# EAGLE schematic MeadowF7MicroDebug_REVB (EAGLE 9.2.2)
REV: A
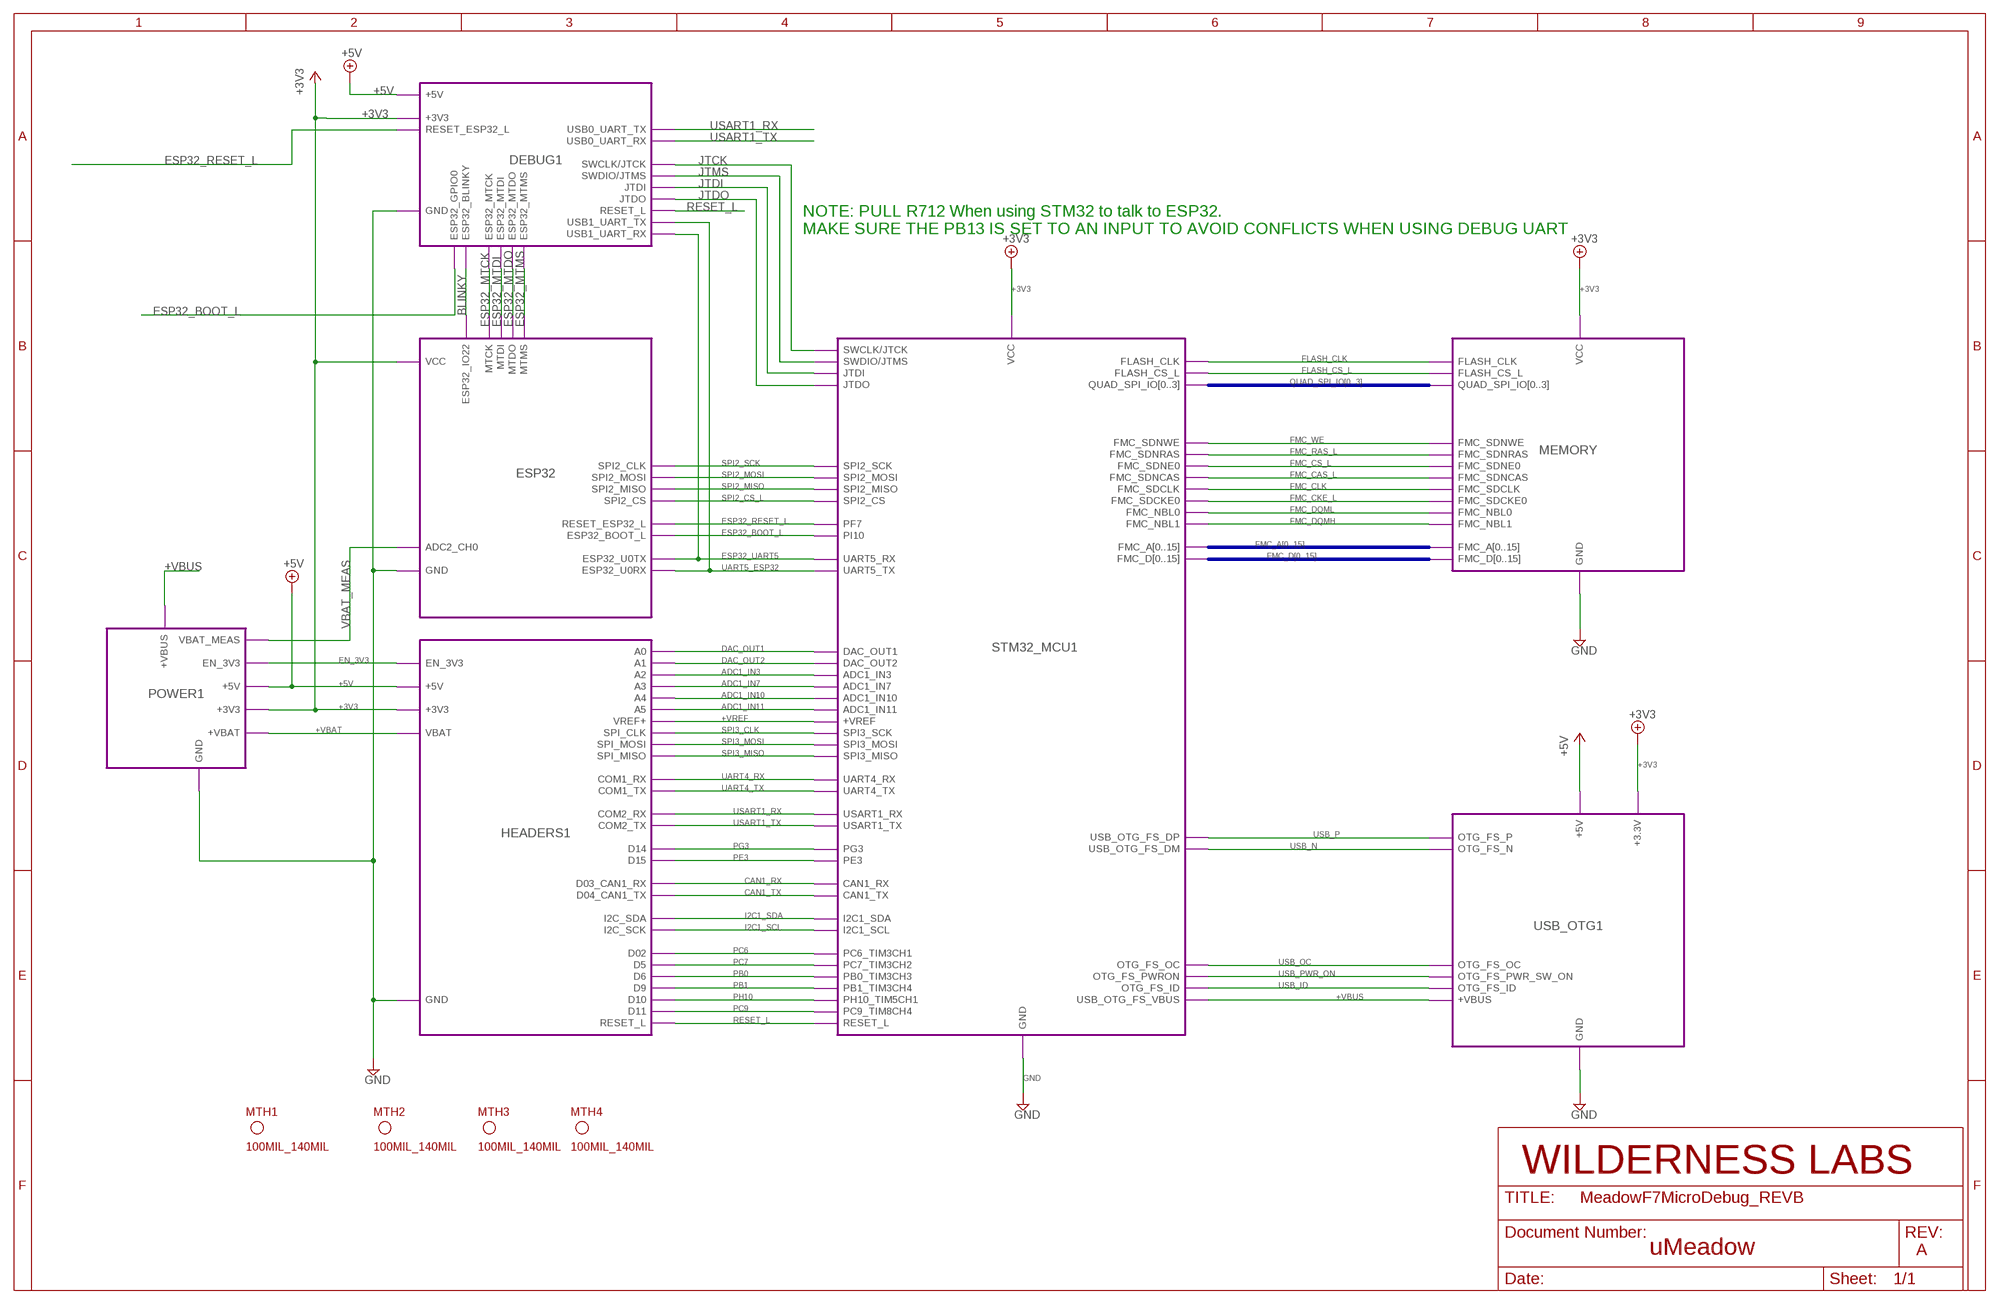
[diagram p0: schematic, sheet 1]

## Parts
MTH1  100MIL_140MIL  MTH_100_140MIL  [MTH_100_140MIL]
MTH2  100MIL_140MIL  MTH_100_140MIL  [MTH_100_140MIL]
MTH3  100MIL_140MIL  MTH_100_140MIL  [MTH_100_140MIL]
MTH4  100MIL_140MIL  MTH_100_140MIL  [MTH_100_140MIL]

## Module instances
STM32_MCU1 = STM32_MCU (part numbers offset by 400)
USB_OTG1 = USB_OTG (part numbers offset by 600)
MEMORY = MEMORY (part numbers offset by 500)
ESP32 = WIFI_BLUETOOTH (part numbers offset by 200)
HEADERS1 = HEADERS (part numbers offset by 300)
POWER1 = POWER (part numbers offset by 100)
DEBUG1 = DEBUG (part numbers offset by 700)

## Nets
+3V3 [POWER]: port HEADERS1.+3V3 ESP32.VCC POWER1.+3V3 DEBUG1.+3V3 USB_OTG1.+3.3V STM32_MCU1.VCC MEMORY.VCC
+5V [5V]: port HEADERS1.+5V POWER1.+5V USB_OTG1.+5V DEBUG1.+5V
+VBAT [CLK]: port POWER1.+VBAT HEADERS1.VBAT
+VBUS [POWER]: port USB_OTG1.+VBUS STM32_MCU1.USB_OTG_FS_VBUS POWER1.+VBUS
+VREF [MEM_DATA]: port STM32_MCU1.+VREF HEADERS1.VREF+
ADC1_IN3 [MEM_DATA]: port STM32_MCU1.ADC1_IN3 HEADERS1.A2
ADC1_IN7 [MEM_DATA]: port STM32_MCU1.ADC1_IN7 HEADERS1.A3
ADC1_IN10 [MEM_DATA]: port HEADERS1.A4 STM32_MCU1.ADC1_IN10
ADC1_IN11 [MEM_DATA]: port STM32_MCU1.ADC1_IN11 HEADERS1.A5
BLINKY: port ESP32.ESP32_IO22 DEBUG1.ESP32_BLINKY
CAN1_RX [MEM_DATA]: port STM32_MCU1.CAN1_RX HEADERS1.D03_CAN1_RX
CAN1_TX [MEM_DATA]: port STM32_MCU1.CAN1_TX HEADERS1.D04_CAN1_TX
DAC_OUT1 [MEM_DATA]: port STM32_MCU1.DAC_OUT1 HEADERS1.A0
DAC_OUT2 [MEM_DATA]: port HEADERS1.A1 STM32_MCU1.DAC_OUT2
EN_3V3: port HEADERS1.EN_3V3 POWER1.EN_3V3
ESP32_BOOT_L: port STM32_MCU1.PI10 ESP32.ESP32_BOOT_L DEBUG1.ESP32_GPIO0
ESP32_MTCK: port DEBUG1.ESP32_MTCK ESP32.MTCK
ESP32_MTDI: port DEBUG1.ESP32_MTDI ESP32.MTDI
ESP32_MTDO: port DEBUG1.ESP32_MTDO ESP32.MTDO
ESP32_MTMS: port DEBUG1.ESP32_MTMS ESP32.MTMS
ESP32_RESET_L: port STM32_MCU1.PF7 ESP32.RESET_ESP32_L DEBUG1.RESET_ESP32_L
ESP32_UART5: port STM32_MCU1.UART5_RX ESP32.ESP32_U0TX DEBUG1.USB1_UART_RX
FLASH_CLK [CLK]: port STM32_MCU1.FLASH_CLK MEMORY.FLASH_CLK
FLASH_CS_L [CLK]: port STM32_MCU1.FLASH_CS_L MEMORY.FLASH_CS_L
FMC_CAS_L [MEM_ADDR_CNT]: port STM32_MCU1.FMC_SDNCAS MEMORY.FMC_SDNCAS
FMC_CKE_L [MEM_ADDR_CNT]: port STM32_MCU1.FMC_SDCKE0 MEMORY.FMC_SDCKE0
FMC_CLK [MEM_ADDR_CNT]: port STM32_MCU1.FMC_SDCLK MEMORY.FMC_SDCLK
FMC_CS_L [MEM_ADDR_CNT]: port STM32_MCU1.FMC_SDNE0 MEMORY.FMC_SDNE0
FMC_DQMH [MEM_DATA]: port MEMORY.FMC_NBL1 STM32_MCU1.FMC_NBL1
FMC_DQML [MEM_DATA]: port STM32_MCU1.FMC_NBL0 MEMORY.FMC_NBL0
FMC_RAS_L [MEM_ADDR_CNT]: port STM32_MCU1.FMC_SDNRAS MEMORY.FMC_SDNRAS
FMC_WE [MEM_ADDR_CNT]: port STM32_MCU1.FMC_SDNWE MEMORY.FMC_SDNWE
GND [POWER]: port ESP32.GND HEADERS1.GND POWER1.GND DEBUG1.GND USB_OTG1.GND MEMORY.GND STM32_MCU1.GND
I2C1_SCL [MEM_DATA]: port STM32_MCU1.I2C1_SCL HEADERS1.I2C_SCK
I2C1_SDA [MEM_DATA]: port STM32_MCU1.I2C1_SDA HEADERS1.I2C_SDA
JTCK: port DEBUG1.SWCLK/JTCK STM32_MCU1.SWCLK/JTCK
JTDI: port STM32_MCU1.JTDI DEBUG1.JTDI
JTDO: port DEBUG1.JTDO STM32_MCU1.JTDO
JTMS: port STM32_MCU1.SWDIO/JTMS DEBUG1.SWDIO/JTMS
PB0 [MEM_DATA]: port STM32_MCU1.PB0_TIM3CH3 HEADERS1.D6
PB1 [MEM_DATA]: port STM32_MCU1.PB1_TIM3CH4 HEADERS1.D9
PC6 [MEM_DATA]: port STM32_MCU1.PC6_TIM3CH1 HEADERS1.D02
PC7 [MEM_DATA]: port STM32_MCU1.PC7_TIM3CH2 HEADERS1.D5
PC9 [MEM_DATA]: port STM32_MCU1.PC9_TIM8CH4 HEADERS1.D11
PE3 [MEM_DATA]: port STM32_MCU1.PE3 HEADERS1.D15
PG3 [MEM_DATA]: port STM32_MCU1.PG3 HEADERS1.D14
PH10 [MEM_DATA]: port STM32_MCU1.PH10_TIM5CH1 HEADERS1.D10
RESET_L [MEM_DATA]: port HEADERS1.RESET_L STM32_MCU1.RESET_L DEBUG1.RESET_L
SPI2_CS_L: port STM32_MCU1.SPI2_CS ESP32.SPI2_CS
SPI2_MISO: port STM32_MCU1.SPI2_MISO ESP32.SPI2_MISO
SPI2_MOSI: port STM32_MCU1.SPI2_MOSI ESP32.SPI2_MOSI
SPI2_SCK: port STM32_MCU1.SPI2_SCK ESP32.SPI2_CLK
SPI3_CLK [MEM_DATA]: port STM32_MCU1.SPI3_SCK HEADERS1.SPI_CLK
SPI3_MISO [MEM_DATA]: port STM32_MCU1.SPI3_MISO HEADERS1.SPI_MISO
SPI3_MOSI [MEM_DATA]: port STM32_MCU1.SPI3_MOSI HEADERS1.SPI_MOSI
UART4_RX [MEM_DATA]: port STM32_MCU1.UART4_RX HEADERS1.COM1_RX
UART4_TX [MEM_DATA]: port STM32_MCU1.UART4_TX HEADERS1.COM1_TX
UART5_ESP32: port ESP32.ESP32_U0RX STM32_MCU1.UART5_TX DEBUG1.USB1_UART_TX
USART1_RX [MEM_DATA]: port STM32_MCU1.USART1_RX HEADERS1.COM2_RX DEBUG1.USB0_UART_TX
USART1_TX [MEM_DATA]: port STM32_MCU1.USART1_TX HEADERS1.COM2_TX DEBUG1.USB0_UART_RX
USB_ID: port USB_OTG1.OTG_FS_ID STM32_MCU1.OTG_FS_ID
USB_N [USB]: port STM32_MCU1.USB_OTG_FS_DM USB_OTG1.OTG_FS_N
USB_OC: port STM32_MCU1.OTG_FS_OC USB_OTG1.OTG_FS_OC
USB_P [USB]: port STM32_MCU1.USB_OTG_FS_DP USB_OTG1.OTG_FS_P
USB_PWR_ON: port USB_OTG1.OTG_FS_PWR_SW_ON STM32_MCU1.OTG_FS_PWRON
VBAT_MEAS: port POWER1.VBAT_MEAS ESP32.ADC2_CH0

## Buses
FMC_D[0..15]
QUAD_SPI_IO[0..3]
FMC_A[0..15]

## Notes on the sheet
- NOTE: PULL R712 When using STM32 to talk to ESP32.
  MAKE SURE THE PB13 IS SET TO AN INPUT TO AVOID CONFLICTS WHEN USING DEBUG UART

## Library data of the parts
MTH1-MTH4 = SLJ_MECH:MTH_100_140MIL: Mounting Hole 100 mil hole 140 copper. No connection; DNI: DNI

## Module STM32_MCU
Ports: SPI2_SCK(out) SPI2_MOSI(out) SPI2_MISO(in) SPI2_CS(out) PF7(out) PI10(out) UART5_RX(in) UART5_TX(out) FMC_A[0..15](out) FMC_D[0..15](io) FMC_NBL1(out) FMC_NBL0(out) FMC_SDCKE0(out) FMC_SDCLK(out) FMC_SDNCAS(out) FMC_SDNE0(out) FMC_SDNRAS(out) FMC_SDNWE(out) FLASH_CLK(out) FLASH_CS_L(out) QUAD_SPI_IO[0..3](io) DAC_OUT1(io) DAC_OUT2(io) ADC1_IN7(io) ADC1_IN10(io) ADC1_IN11(io) ADC1_IN3(io) +VREF(pas) SPI3_SCK(io) SPI3_MOSI(io) SPI3_MISO(io) UART4_RX(in) UART4_TX(out) USART1_TX(out) USART1_RX(in) PG3(io) PE3(io) CAN1_RX(io) CAN1_TX(io) I2C1_SDA(io) I2C1_SCL(io) PC6_TIM3CH1(io) PC7_TIM3CH2(io) PB0_TIM3CH3(io) PB1_TIM3CH4(io) PH10_TIM5CH1(io) PC9_TIM8CH4(io) RESET_L(io) OTG_FS_OC(in) OTG_FS_ID(in) USB_OTG_FS_VBUS(in) OTG_FS_PWRON(out) USB_OTG_FS_DP(io) USB_OTG_FS_DM(io) VCC(pwr) GND(pwr) SWCLK/JTCK(io) SWDIO/JTMS(io) JTDI(io) JTDO(io)
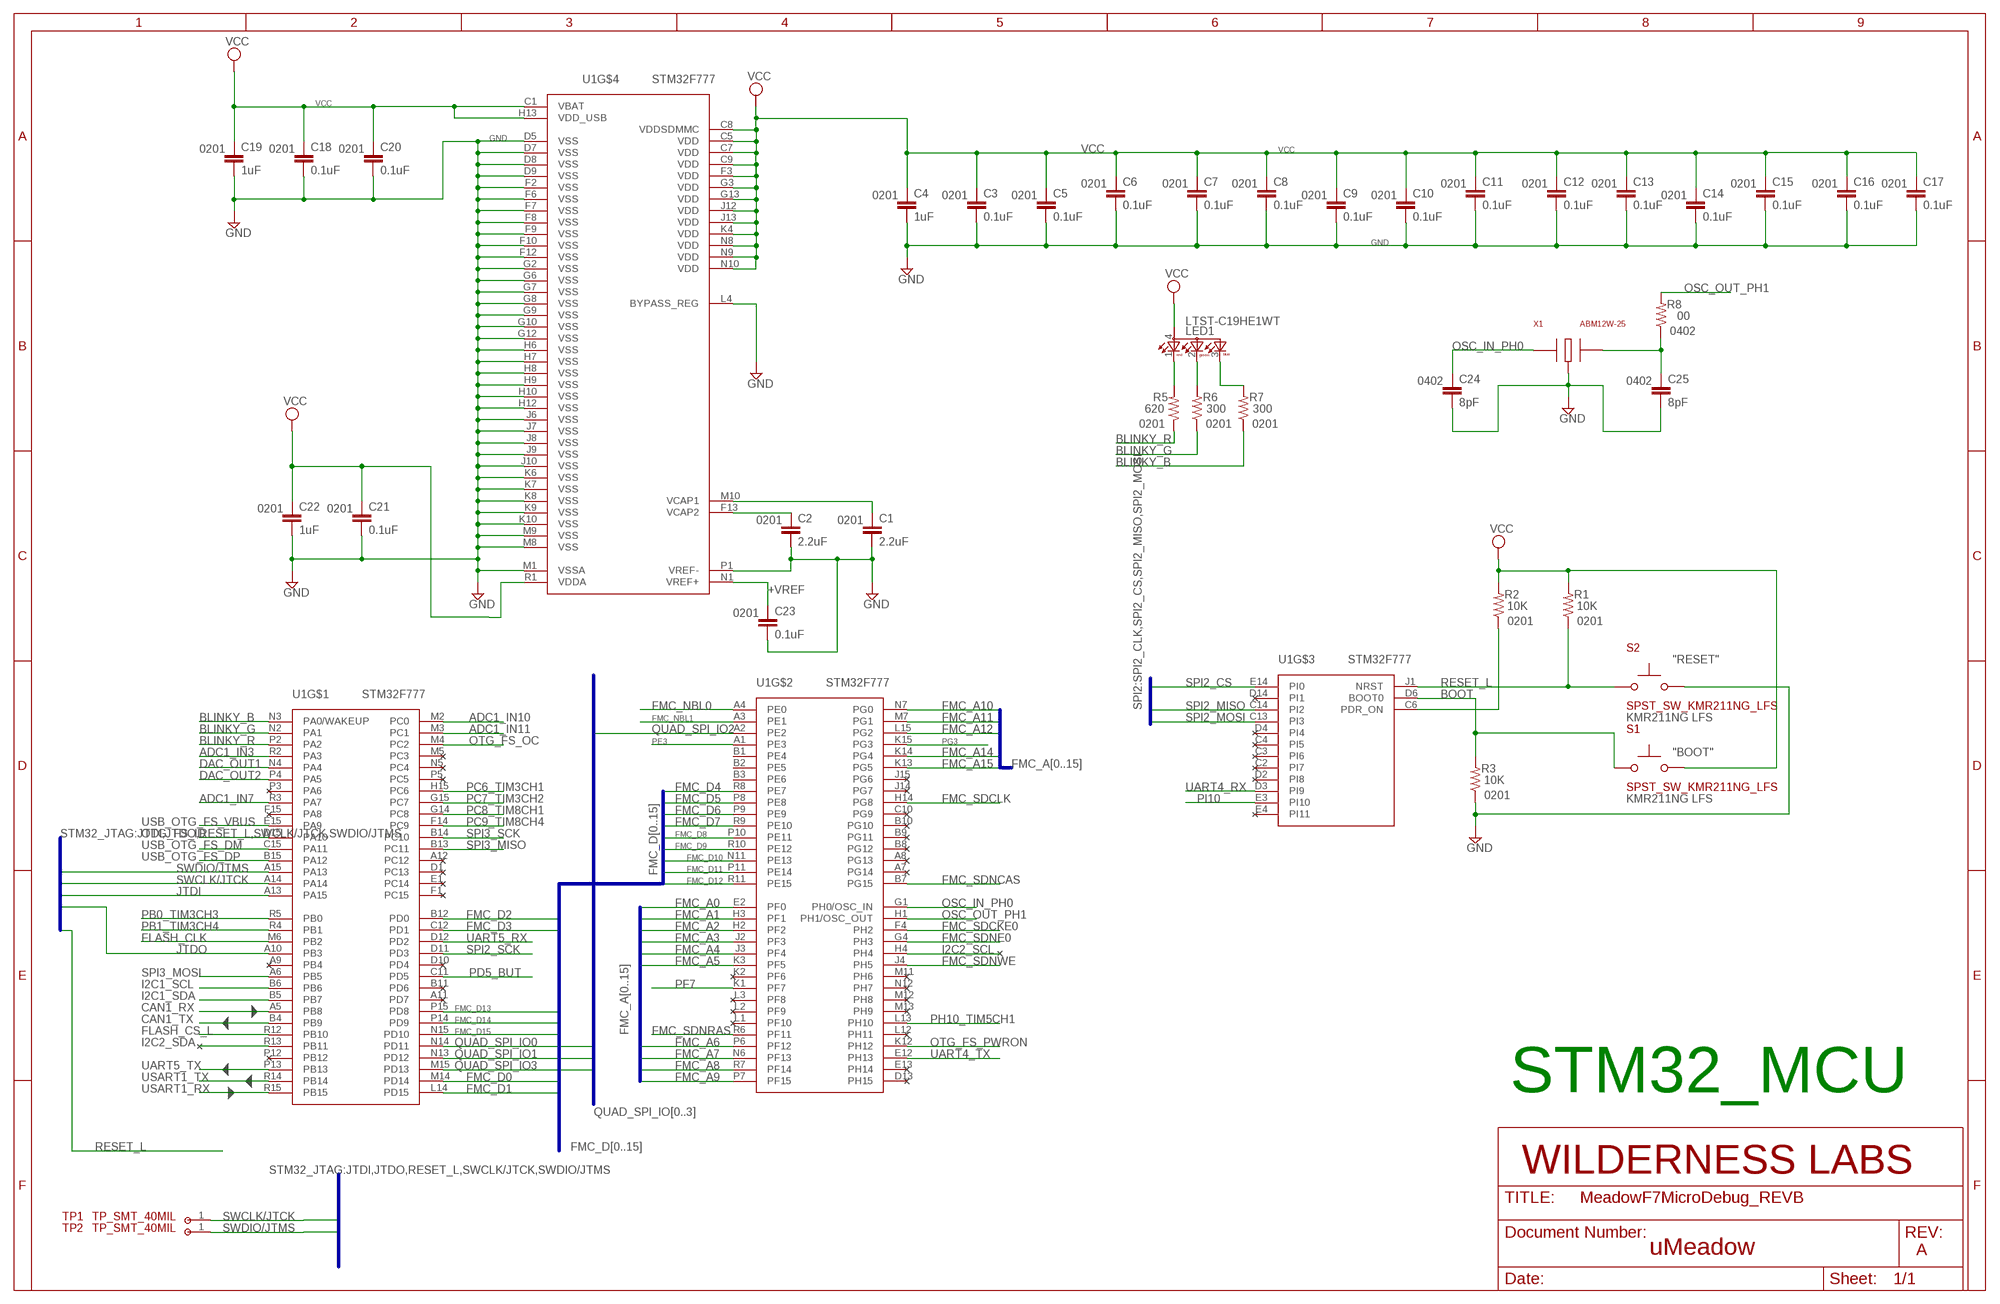
[diagram p1: schematic, module STM32_MCU, sheet 1]

### Parts
C1  2.2uF  CC0201  [C0201]
C2  2.2uF  CC0201  [C0201]
C3  0.1uF  CC0201  [C0201]
C4  1uF  CC0201  [C0201]
C5  0.1uF  CC0201  [C0201]
C6  0.1uF  CC0201  [C0201]
C7  0.1uF  CC0201  [C0201]
C8  0.1uF  CC0201  [C0201]
C9  0.1uF  CC0201  [C0201]
C10  0.1uF  CC0201  [C0201]
C11  0.1uF  CC0201  [C0201]
C12  0.1uF  CC0201  [C0201]
C13  0.1uF  CC0201  [C0201]
C14  0.1uF  CC0201  [C0201]
C15  0.1uF  CC0201  [C0201]
C16  0.1uF  CC0201  [C0201]
C17  0.1uF  CC0201  [C0201]
C18  0.1uF  CC0201  [C0201]
C19  1uF  CC0201  [C0201]
C20  0.1uF  CC0201  [C0201]
C21  0.1uF  CC0201  [C0201]
C22  1uF  CC0201  [C0201]
C23  0.1uF  CC0201  [C0201]
C24  8pF  CC0402  [C0402]
C25  8pF  CC0402  [C0402]
LED1  LTST-C19HE1WT  [LTST-C19HE1WT]
R1  10K  R-US_R0201  [R0201]
R2  10K  R-US_R0201  [R0201]
R3  10K  R-US_R0201  [R0201]
R5  620  R-US_R0201  [R0201]
R6  300  R-US_R0201  [R0201]
R7  300  R-US_R0201  [R0201]
R8  00  R-US_R0402  [R0402]
S1  SPST_SW_KMR211NG_LFS  [KMR211NG]
S2  SPST_SW_KMR211NG_LFS  [KMR211NG]
TP1  TP_SMT_40MIL  [TP_SMT_40MIL]
TP2  TP_SMT_40MIL  [TP_SMT_40MIL]
U1  STM32F777  [UFBGA-176]
X1  ABM12W-25  [OSCCC160X120X40]

### Nets
+VREF: C23.1 U1.N1(VREF+)
ADC1_IN3: U1.R2(PA3)
ADC1_IN7: U1.R3(PA7)
ADC1_IN10: U1.M2(PC0)
ADC1_IN11: U1.M3(PC1)
BLINKY_B: R7.1 U1.N3(PA0/WAKEUP)
BLINKY_G: R6.1 U1.N2(PA1)
BLINKY_R: R5.1 U1.P2(PA2)
BOOT: R3.2 S1.1(1_4) S1.2(1_4) U1.D6(BOOT0)
CAN1_RX: U1.A5(PB8)
CAN1_TX: U1.B4(PB9)
DAC_OUT1: U1.N4(PA4)
DAC_OUT2: U1.P4(PA5)
FLASH_CLK: U1.M6(PB2)
FLASH_CS_L: U1.R12(PB10)
FMC_A0 [MEM_ADDR_CNT]: U1.E2(PF0)
FMC_A1 [MEM_ADDR_CNT]: U1.H3(PF1)
FMC_A2 [MEM_ADDR_CNT]: U1.H2(PF2)
FMC_A3 [MEM_ADDR_CNT]: U1.J2(PF3)
FMC_A4 [MEM_ADDR_CNT]: U1.J3(PF4)
FMC_A5 [MEM_ADDR_CNT]: U1.K3(PF5)
FMC_A6: U1.P6(PF12)
FMC_A7: U1.N6(PF13)
FMC_A8: U1.R7(PF14)
FMC_A9: U1.P7(PF15)
FMC_A10: U1.N7(PG0)
FMC_A11: U1.M7(PG1)
FMC_A12: U1.L15(PG2)
FMC_A14: U1.K14(PG4)
FMC_A15: U1.K13(PG5)
FMC_D0 [MEM_DATA]: U1.M14(PD14)
FMC_D1 [MEM_DATA]: U1.L14(PD15)
FMC_D2 [MEM_DATA]: U1.B12(PD0)
FMC_D3 [MEM_DATA]: U1.C12(PD1)
FMC_D4 [MEM_DATA]: U1.R8(PE7)
FMC_D5 [MEM_DATA]: U1.P8(PE8)
FMC_D6 [MEM_DATA]: U1.P9(PE9)
FMC_D7 [MEM_DATA]: U1.R9(PE10)
FMC_D8 [MEM_DATA]: U1.P10(PE11)
FMC_D9 [MEM_DATA]: U1.R10(PE12)
FMC_D10 [MEM_DATA]: U1.N11(PE13)
FMC_D11 [MEM_DATA]: U1.P11(PE14)
FMC_D12 [MEM_DATA]: U1.R11(PE15)
FMC_D13 [MEM_DATA]: U1.P15(PD8)
FMC_D14 [MEM_DATA]: U1.P14(PD9)
FMC_D15 [MEM_DATA]: U1.N15(PD10)
FMC_NBL0: U1.A4(PE0)
FMC_NBL1: U1.A3(PE1)
FMC_SDCKE0: U1.F4(PH2)
FMC_SDCLK: U1.H14(PG8)
FMC_SDNCAS: U1.B7(PG15)
FMC_SDNE0: U1.G4(PH3)
FMC_SDNRAS: U1.R6(PF11)
FMC_SDNWE: U1.J4(PH5)
GND: C1.2 C2.2 C3.2 C4.2 C5.2 C6.2 C7.2 C8.2 C9.2 C10.2 C11.2 C12.2 C13.2 C14.2 C15.2 C16.2 C17.2 C18.2 C19.2 C20.2 C21.2 C22.2 C23.2 C24.2 C25.2 R3.1 S2.3(2_3) S2.4(2_3) U1.D5(VSS) U1.D7(VSS) U1.D8(VSS) U1.D9(VSS) U1.F2(VSS) U1.F6(VSS) U1.F7(VSS) U1.F8(VSS) U1.F9(VSS) U1.F10(VSS) U1.F12(VSS) U1.G2(VSS) U1.G6(VSS) U1.G7(VSS) U1.G8(VSS) U1.G9(VSS) U1.G10(VSS) U1.G12(VSS) U1.H6(VSS) U1.H7(VSS) U1.H8(VSS) U1.H9(VSS) U1.H10(VSS) U1.H12(VSS) U1.J6(VSS) U1.J7(VSS) U1.J8(VSS) U1.J9(VSS) U1.J10(VSS) U1.K6(VSS) U1.K7(VSS) U1.K8(VSS) U1.K9(VSS) U1.K10(VSS) U1.L4(BYPASS_REG) U1.M1(VSSA) U1.M8(VSS) U1.M9(VSS) U1.P1(VREF-) X1.2(GND) X1.4(GND)
I2C1_SCL: U1.B6
I2C1_SDA: U1.B5(PB7)
I2C2_SCL: U1.H4
I2C2_SDA: U1.R13(PB11)
JTDI: U1.A13(PA15)
JTDO: U1.A10(PB3)
N$1: C1.1 U1.M10(VCAP1)
N$2: C2.1 U1.F13(VCAP2)
N$7: LED1.1(CRED) R5.2
N$8: R2.1 U1.C6(PDR_ON)
N$9: LED1.2(CGREEN) R6.2
N$11: LED1.3(CBLUE) R7.2
N$14: C25.1 R8.1 X1.3(OUT)
OSC_IN_PH0: C24.1 U1.G1(PH0/OSC_IN) X1.1(IN)
OSC_OUT_PH1: R8.2 U1.H1(PH1/OSC_OUT)
OTG_FS_ID: U1.D15(PA10)
OTG_FS_OC: U1.M4(PC2)
OTG_FS_PWRON: U1.K12(PH12)
PB0_TIM3CH3: U1.R5(PB0)
PB1_TIM3CH4: U1.R4(PB1)
PC6_TIM3CH1: U1.H15(PC6)
PC7_TIM3CH2: U1.G15(PC7)
PC8_TIM8CH1: U1.G14(PC8)
PC9_TIM8CH4: U1.F14(PC9)
PD5_BUT: U1.C11(PD5)
PE3 [MEM_DATA]: U1.A1(PE3)
PF7: U1.K1(PF7)
PG3: U1.K15(PG3)
PH10_TIM5CH1: U1.L13(PH10)
PI10: U1.E3(PI10)
QUAD_SPI_IO0: U1.N14(PD11)
QUAD_SPI_IO1: U1.N13(PD12)
QUAD_SPI_IO2: U1.A2(PE2)
QUAD_SPI_IO3: U1.M15(PD13)
RESET_L: R1.1 S2.1(1_4) S2.2(1_4) U1.J1(NRST)
SPI2_CS: U1.E14(PI0)
SPI2_MISO: U1.C14(PI2)
SPI2_MOSI: U1.C13(PI3)
SPI2_SCK: U1.D11(PD3)
SPI3_MISO: U1.B13(PC11)
SPI3_MOSI: U1.A6(PB5)
SPI3_SCK: U1.B14(PC10)
SWCLK/JTCK: TP1.1 U1.A14
SWDIO/JTMS: TP2.1 U1.A15(PA13)
UART4_RX: U1.D3(PI9)
UART4_TX: U1.E12(PH13)
UART5_RX: U1.D12(PD2)
UART5_TX: U1.P13(PB13)
USART1_RX: U1.R15(PB15)
USART1_TX: U1.R14(PB14)
USB_OTG_FS_DM: U1.C15(PA11)
USB_OTG_FS_DP: U1.B15(PA12)
USB_OTG_FS_VBUS: U1.E15(PA9)
VCC: C3.1 C4.1 C5.1 C6.1 C7.1 C8.1 C9.1 C10.1 C11.1 C12.1 C13.1 C14.1 C15.1 C16.1 C17.1 C18.1 C19.1 C20.1 C21.1 C22.1 LED1.4(A) R1.2 R2.2 S1.3(2_3) S1.4(2_3) U1.C1(VBAT) U1.C5(VDD) U1.C7(VDD) U1.C8(VDDSDMMC) U1.C9(VDD) U1.F3(VDD) U1.G3(VDD) U1.G13(VDD) U1.H13(VDD_USB) U1.J12(VDD) U1.J13(VDD) U1.K4(VDD) U1.N8(VDD) U1.N9(VDD) U1.N10(VDD) U1.R1(VDDA)
Unconnected: U1.A7(PG14) U1.A8(PG13) U1.A9(PB4) U1.A11(PD7) U1.A12(PC12) U1.B1(PE4) U1.B2(PE5) U1.B3(PE6) U1.B8(PG12) U1.B9(PG11) U1.B10(PG10) U1.B11(PD6) U1.C2(PI7) U1.C3(PI6) U1.C4(PI5) U1.C10(PG9) U1.D1(PC13) U1.D2(PI8) U1.D4(PI4) U1.D10(PD4) U1.D13(PH15) U1.D14(PI1) U1.E1(PC14) U1.E4(PI11) U1.E13(PH14) U1.F1(PC15) U1.F15(PA8) U1.J14(PG7) U1.J15(PG6) U1.K2(PF6) U1.L1(PF10) U1.L2(PF9) U1.L3(PF8) U1.L12(PH11) U1.M5(PC3) U1.M11(PH6) U1.M12(PH8) U1.M13(PH9) U1.N5(PC4) U1.N12(PH7) U1.P3(PA6) U1.P5(PC5) U1.P12(PB12)

### Buses
FMC_A[0..15]
FMC_D[0..15]
SPI2:SPI2_CLK,SPI2_CS,SPI2_MISO,SPI2_MOSI
QUAD_SPI_IO[0..3]
STM32_JTAG:JTDI,JTDO,RESET_L,SWCLK/JTCK,SWDIO/JTMS

### Notes on the sheet
- "RESET"
- "BOOT"

### Library data of the parts
C1 C2 = eagle-ltspice:C: CAPACITOR, European symbol; FOOTPRINT: 0201; MANUFACTURER: Murata Electronica; PART_NUMBER: GRM033R61A225KE47D; SPICEMODEL: NONE; SPICEPREFIX: C; VOLTAGE: 10V
C3 C5-C18 C20 C21 C23 = eagle-ltspice:C: CAPACITOR, European symbol; FOOTPRINT: 0201; MANUFACTURER: Murata Electronica; PART_NUMBER: GRM033R61A104ME15D; SPICEMODEL: NONE; SPICEPREFIX: C; VOLTAGE: 10V
C4 C19 C22 = eagle-ltspice:C: CAPACITOR, European symbol; FOOTPRINT: 0201; MANUFACTURER: Murata Electronica; PART_NUMBER: GRT033R60J105ME13D; SPICEMODEL: NONE; SPICEPREFIX: C; VOLTAGE: 6.3V
C24 C25 = eagle-ltspice:C: CAPACITOR, European symbol; FOOTPRINT: 0402; MANUFACTURER: Murata Electronica; PART_NUMBER: GRM1555C1H8R0DA01D; SPICEMODEL: NONE; SPICEPREFIX: C; VOLTAGE: 50V
LED1 = SLJ_Diodes:LTST-C19HE1WT: Chip LED RGB Source: http://document.sharpsma.com/files/GM1WA55311A_SS.pdf; MANUFACTURER: LITE-ON; PART_NUMBER: LTST-C19HE1WT
R1-R3 = rcl:R-US_: RESISTOR, American symbol; FOOTPRINT: 0201; MANUFACTURER: Yageo; PART_NUMBER: RC0201FR-0710KL; SPICEPREFIX: R
R5 = rcl:R-US_: RESISTOR, American symbol; FOOTPRINT: 0201; MANUFACTURER: Yageo; PART_NUMBER: RC0201JR-07620RL; SPICEPREFIX: R
R6 R7 = rcl:R-US_: RESISTOR, American symbol; FOOTPRINT: 0201; MANUFACTURER: Yageo; PART_NUMBER: RC0201FR-07300RL; SPICEPREFIX: R
R8 = rcl:R-US_: RESISTOR, American symbol; FOOTPRINT: 0402; MANUFACTURER: Panasonic; PART_NUMBER: ERJ-2GE0R00X; SPICEPREFIX: R
S1 S2 = SLJ_SWITCHES:SPST_SW_KMR211NG_LFS; MANUFACTURER: C&K; PART_NUMBER: KMR211NG LFS
TP1 TP2 = SLJ_MECH:TP_SMT_40MIL: SMT Test point
U1 = STM32_MCU:STM32F777; MANUFACTURER: STMicroelectronics; PART_NUMBER: STM32F777IIK6
X1 = SLJ_OSC:ABM12W-25; MANUFACTURER: Abracon LLC; PART_NUMBER: ABM12W-25.0000MHZ-6-B1U-T3

## Module USB_OTG
Ports: +VBUS(out) OTG_FS_ID(out) OTG_FS_PWR_SW_ON(in) OTG_FS_OC(out) OTG_FS_P(io) OTG_FS_N(io) +5V(pwr) +3.3V(pwr) GND(pwr)
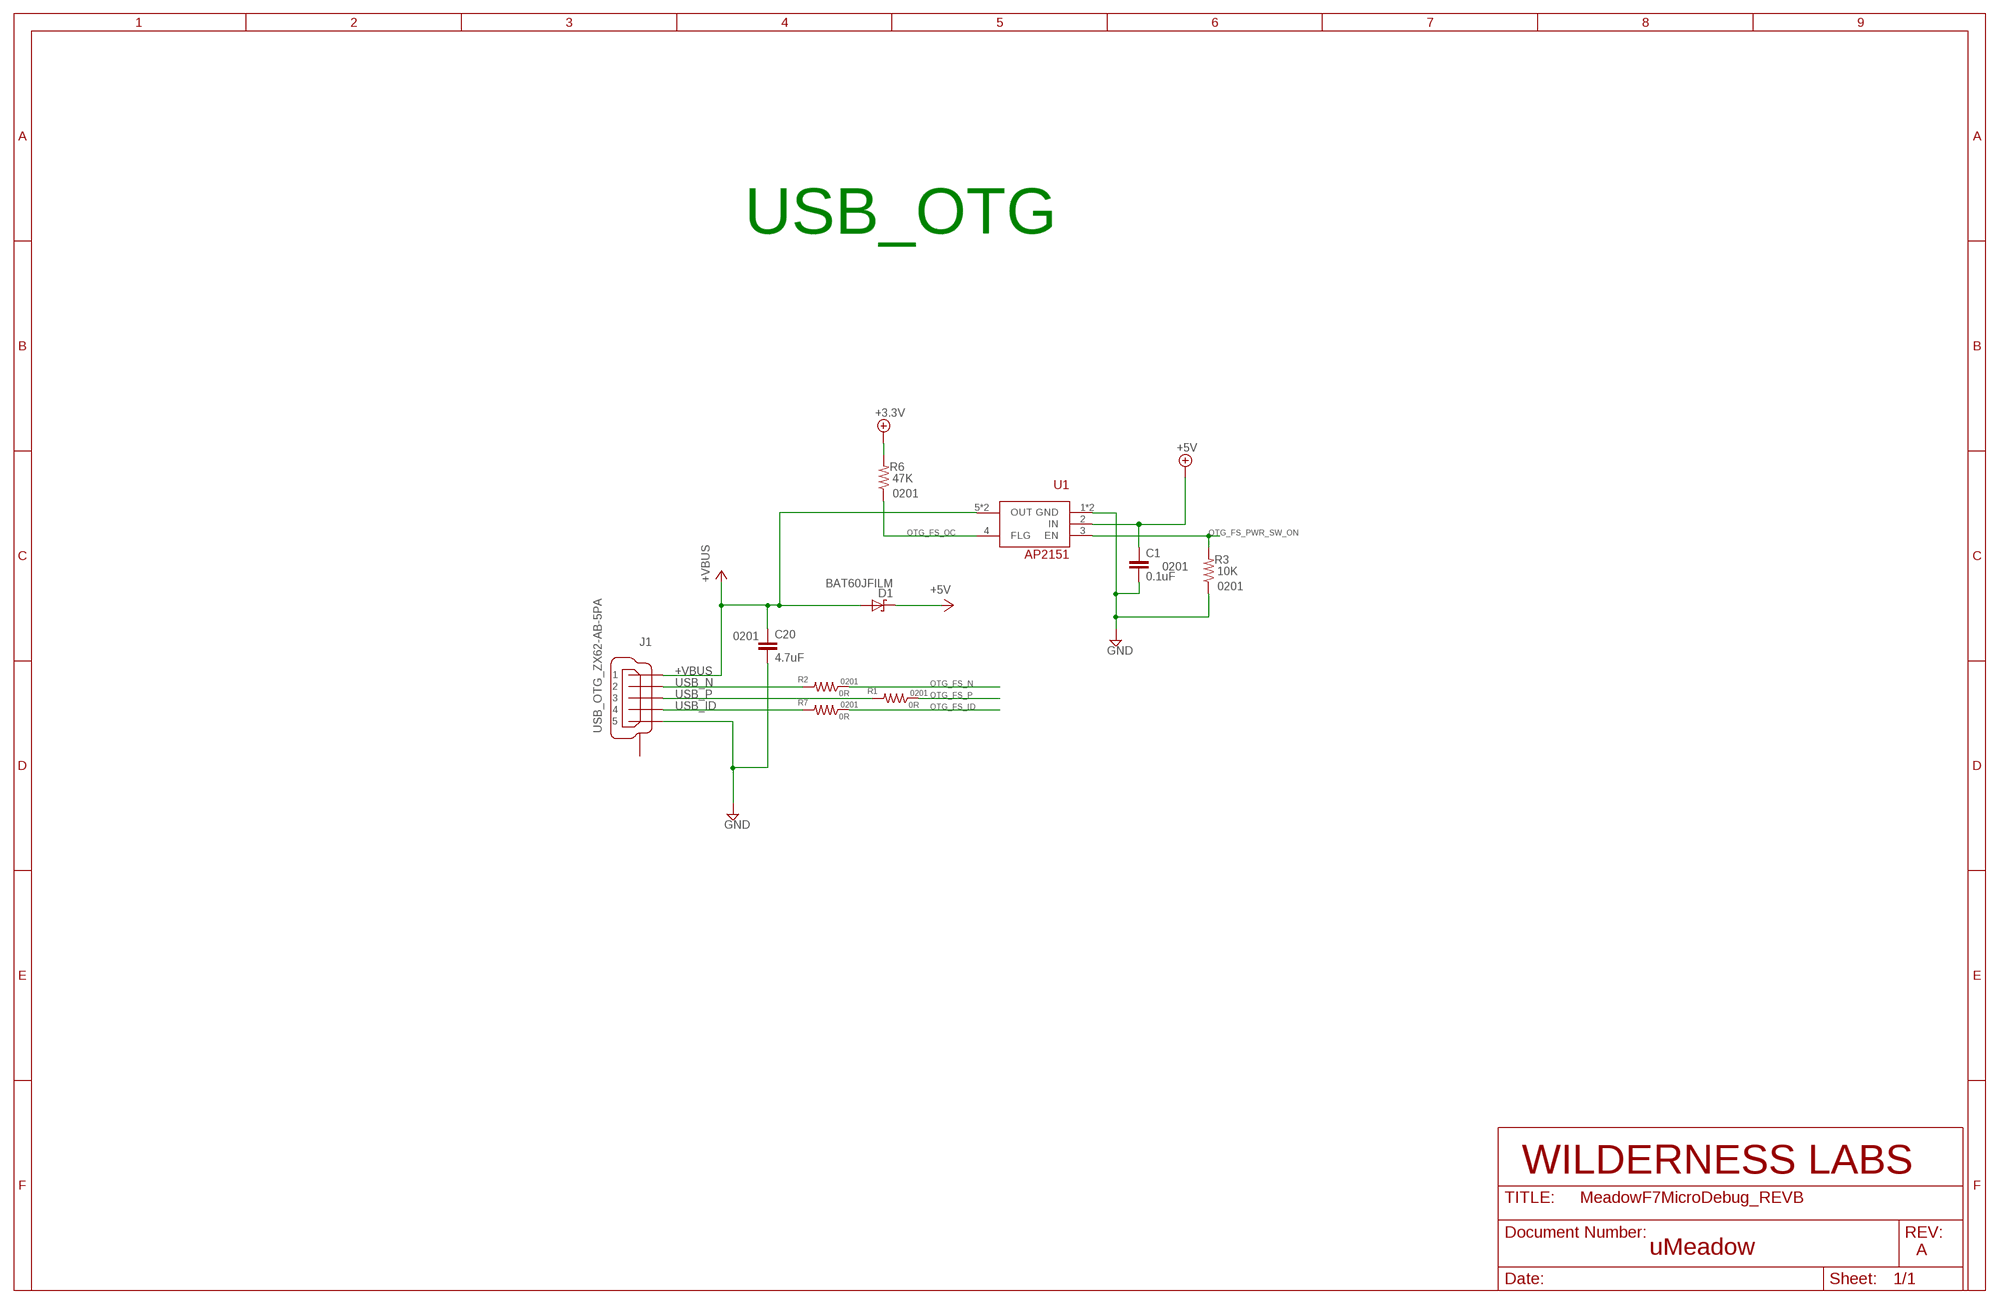
[diagram p2: schematic, module USB_OTG, sheet 1]

### Parts
C1  0.1uF  CC0201  [C0201]
C20  4.7uF  CC0201  [C0201]
D1  BAT60JFILM  [SOD2512X117]
J1  USB_OTG_ZX62-AB-5PA  [USB_OTG]
R1  0R  R-US_R0201  [R0201]
R2  0R  R-US_R0201  [R0201]
R3  10K  R-US_R0201  [R0201]
R6  47K  R-US_R0201  [R0201]
R7  0R  R-US_R0201  [R0201]
U1  AP2151  [U-DFN2018-6]

### Nets
+3.3V: R6.2
+5V: C1.1 D1.1(C) U1.2(IN)
+VBUS: C20.1 D1.2(A) J1.1 U1.5(OUT) U1.6(OUT)
GND: C1.2 C20.2 J1.5 R3.1 U1.1(GND) U1.TAB(GND)
OTG_FS_ID: R7.1
OTG_FS_N: R2.1
OTG_FS_OC: R6.1 U1.4(FLG)
OTG_FS_P: R1.1
OTG_FS_PWR_SW_ON: R3.2 U1.3(EN)
USB_ID: J1.4 R7.2
USB_N [USB]: J1.2 R2.2
USB_P [USB]: J1.3 R1.2
Unconnected: J1.SHD1(SHIELD) J1.SHD2(SHIELD) J1.SHD3(SHIELD) J1.SHD4(SHIELD) J1.SHD5(SHIELD) J1.SHD6(SHIELD)

### Library data of the parts
C1 = eagle-ltspice:C: CAPACITOR, European symbol; FOOTPRINT: 0201; MANUFACTURER: Murata Electronica; PART_NUMBER: GRM033R61A104ME15D; SPICEMODEL: NONE; SPICEPREFIX: C; VOLTAGE: 10V
C20 = eagle-ltspice:C: CAPACITOR, European symbol; FOOTPRINT: 0201; MANUFACTURER: Murata Electronica; PART_NUMBER: GRM035R60J475ME15D; SPICEMODEL: NONE; SPICEPREFIX: C; VOLTAGE: 6.3V
D1 = SLJ_Diodes:BAT60JFILM: Schottky Diode STM BAT60 http://www.st.com/content/ccc/resource/technical/document/datasheet/3d/d2/27/1d/20/e3/4d/48/CD00001944.pdf/files/CD00001944.pdf/jcr:content/translations/en.CD00001944.pdf; MANUFACTURER: STMicroelectronics; PART_NUMBER: BAT60JFILM
J1 = SLJ_Connectors:USB_OTG_ZX62-AB-5PA: USB OTG Connetor, SMT; MANUFACTURER: Hirose Electric Co.; PART_NUMBER: ZX62-AB-5PA(31)
R1 R2 R7 = rcl:R-US_: RESISTOR, American symbol; FOOTPRINT: 0201; MANUFACTURER: Panasonic; PART_NUMBER: ERJ-1GN0R00C; SPICEPREFIX: R
R3 = rcl:R-US_: RESISTOR, American symbol; FOOTPRINT: 0201; MANUFACTURER: Yageo; PART_NUMBER: RC0201FR-0710KL; SPICEPREFIX: R
R6 = rcl:R-US_: RESISTOR, American symbol; FOOTPRINT: 0201; MANUFACTURER: Samsung Electro-Mechanics; PART_NUMBER: RC0603F473CS; SPICEPREFIX: R
U1 = SLJ_PMIC:AP2151: IC PWR SW USB X1-DFN2018-6 500mA; MANUFACTURER: Diodes Inc; PART_NUMBER: AP2151DFMG-7

## Module MEMORY
Ports: FMC_A[0..15](in) FMC_D[0..15](io) FMC_NBL1(in) FMC_NBL0(in) FMC_SDCKE0(in) FMC_SDCLK(in) FMC_SDNCAS(in) FMC_SDNE0(in) FMC_SDNRAS(in) FMC_SDNWE(in) FLASH_CLK(in) FLASH_CS_L(in) QUAD_SPI_IO[0..3](io) VCC(pwr) GND(pwr)
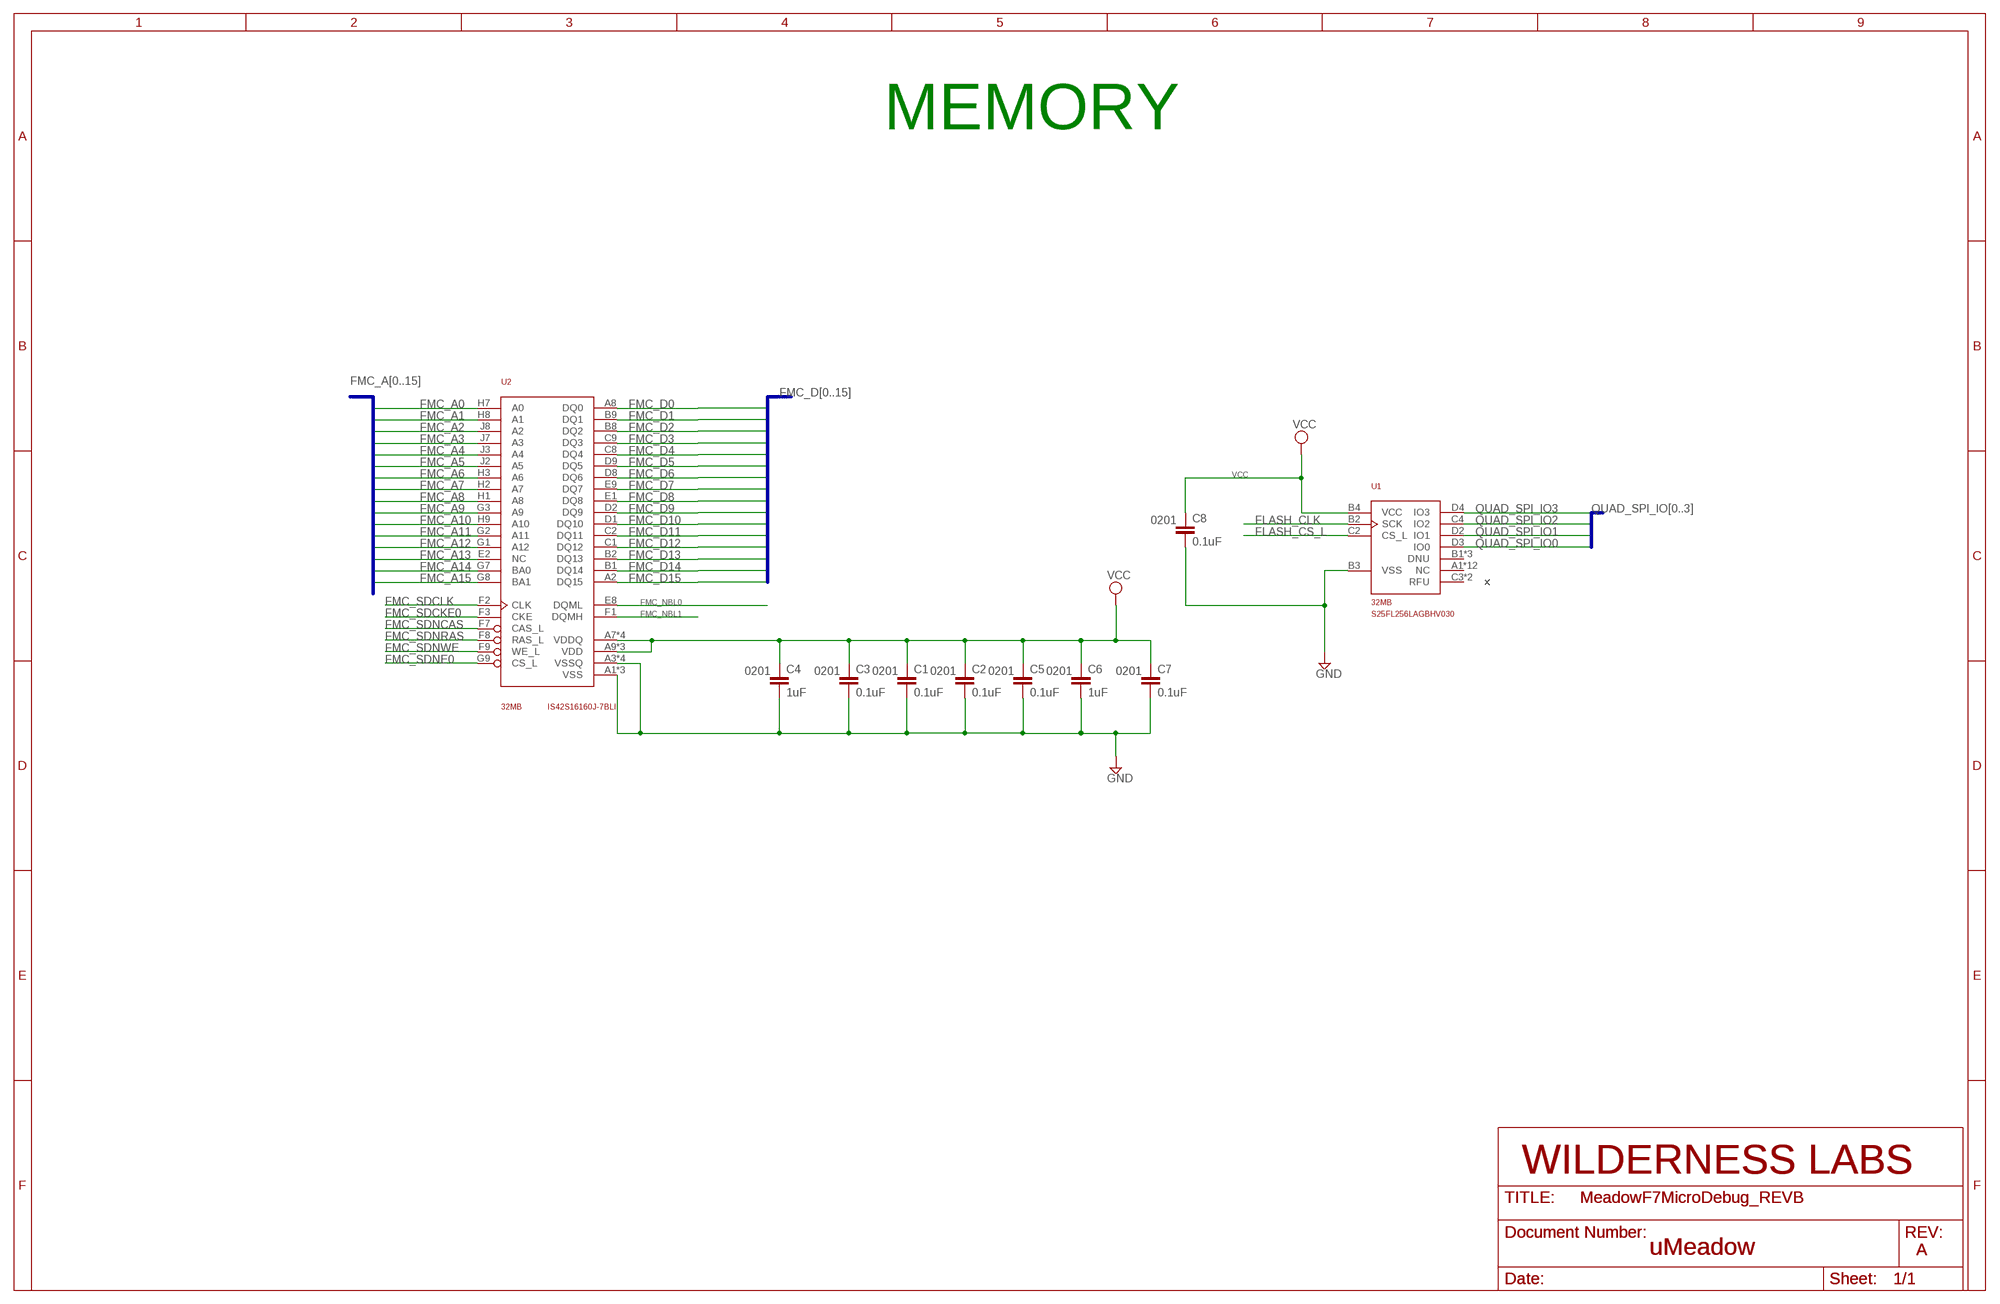
[diagram p3: schematic, module MEMORY, sheet 1]

### Parts
C1  0.1uF  CC0201  [C0201]
C2  0.1uF  CC0201  [C0201]
C3  0.1uF  CC0201  [C0201]
C4  1uF  CC0201  [C0201]
C5  0.1uF  CC0201  [C0201]
C6  1uF  CC0201  [C0201]
C7  0.1uF  CC0201  [C0201]
C8  0.1uF  CC0201  [C0201]
U1  32MB  S25FL256  [BGA25C100P5X5_800X600X120]
U2  32MB  IS42S16160J  [BGA81C80P9X9_800X800X120]

### Nets
FLASH_CLK: U1.B2(SCK)
FLASH_CS_L: U1.C2(CS_L)
FMC_A0 [MEM_ADDR_CNT]: U2.H7(A0)
FMC_A1 [MEM_ADDR_CNT]: U2.H8(A1)
FMC_A2 [MEM_ADDR_CNT]: U2.J8(A2)
FMC_A3 [MEM_ADDR_CNT]: U2.J7(A3)
FMC_A4 [MEM_ADDR_CNT]: U2.J3(A4)
FMC_A5 [MEM_ADDR_CNT]: U2.J2(A5)
FMC_A6 [MEM_ADDR_CNT]: U2.H3(A6)
FMC_A7 [MEM_ADDR_CNT]: U2.H2(A7)
FMC_A8 [MEM_ADDR_CNT]: U2.H1(A8)
FMC_A9 [MEM_ADDR_CNT]: U2.G3(A9)
FMC_A10 [MEM_ADDR_CNT]: U2.H9(A10)
FMC_A11 [MEM_ADDR_CNT]: U2.G2(A11)
FMC_A12 [MEM_ADDR_CNT]: U2.G1(A12)
FMC_A13 [MEM_ADDR_CNT]: U2.E2(NC)
FMC_A14 [MEM_ADDR_CNT]: U2.G7(BA0)
FMC_A15 [MEM_ADDR_CNT]: U2.G8(BA1)
FMC_D0 [MEM_DATA]: U2.A8(DQ0)
FMC_D1 [MEM_DATA]: U2.B9(DQ1)
FMC_D2 [MEM_DATA]: U2.B8(DQ2)
FMC_D3 [MEM_DATA]: U2.C9(DQ3)
FMC_D4 [MEM_DATA]: U2.C8(DQ4)
FMC_D5 [MEM_DATA]: U2.D9(DQ5)
FMC_D6 [MEM_DATA]: U2.D8(DQ6)
FMC_D7 [MEM_DATA]: U2.E9(DQ7)
FMC_D8 [MEM_DATA]: U2.E1(DQ8)
FMC_D9 [MEM_DATA]: U2.D2(DQ9)
FMC_D10 [MEM_DATA]: U2.D1(DQ10)
FMC_D11 [MEM_DATA]: U2.C2(DQ11)
FMC_D12 [MEM_DATA]: U2.C1(DQ12)
FMC_D13 [MEM_DATA]: U2.B2(DQ13)
FMC_D14 [MEM_DATA]: U2.B1(DQ14)
FMC_D15 [MEM_DATA]: U2.A2(DQ15)
FMC_NBL0: U2.E8(DQML)
FMC_NBL1: U2.F1(DQMH)
FMC_SDCKE0: U2.F3(CKE)
FMC_SDCLK: U2.F2(CLK)
FMC_SDNCAS: U2.F7(CAS_L)
FMC_SDNE0: U2.G9(CS_L)
FMC_SDNRAS: U2.F8(RAS_L)
FMC_SDNWE: U2.F9(WE_L)
GND: C1.2 C2.2 C3.2 C4.2 C5.2 C6.2 C7.2 C8.2 U1.B3(VSS) U2.A1(VSS) U2.A3(VSSQ) U2.B7(VSSQ) U2.C3(VSSQ) U2.D7(VSSQ) U2.E3(VSS) U2.J1(VSS)
QUAD_SPI_IO0 [50ohm]: U1.D3(IO0)
QUAD_SPI_IO1 [50ohm]: U1.D2(IO1)
QUAD_SPI_IO2 [50ohm]: U1.C4(IO2)
QUAD_SPI_IO3 [50ohm]: U1.D4(IO3)
VCC: C1.1 C2.1 C3.1 C4.1 C5.1 C6.1 C7.1 C8.1 U1.B4(VCC) U2.A7(VDDQ) U2.A9(VDD) U2.B3(VDDQ) U2.C7(VDDQ) U2.D3(VDDQ) U2.E7(VDD) U2.J9(VDD)
Unconnected: U1.A1(NC) U1.A2(NC) U1.A3(NC) U1.A4(NC) U1.A5(NC) U1.B1(DNU) U1.B5(NC) U1.C1(DNU) U1.C3(RFU) U1.C5(NC) U1.D1(DNU) U1.D5(NC) U1.E1(NC) U1.E2(NC) U1.E3(NC) U1.E4(RFU) U1.E5(NC)

### Buses
FMC_A[0..15]
FMC_D[0..15]
QUAD_SPI_IO[0..3]

### Library data of the parts
C1-C3 C5 C7 C8 = eagle-ltspice:C: CAPACITOR, European symbol; FOOTPRINT: 0201; MANUFACTURER: Murata Electronica; PART_NUMBER: GRM033R61A104ME15D; SPICEMODEL: NONE; SPICEPREFIX: C; VOLTAGE: 10V
C4 C6 = eagle-ltspice:C: CAPACITOR, European symbol; FOOTPRINT: 0201; MANUFACTURER: Murata Electronica; PART_NUMBER: GRT033R60J105ME13D; SPICEMODEL: NONE; SPICEPREFIX: C; VOLTAGE: 6.3V
U1 = SLJ_Memory:S25FL256: FLASH - NOR Memory IC 256Mb (32M x 8) SPI - Quad I/O, QPI 133MHz 24-BGA (6x8); MANUFACTURER: Cypress Semiconductor; PART_NUMBER: S25FL256LAGBHV030
U2 = SLJ_Memory:IS42S16160J: SDRAM Memory IC 256Mb (16M x 16) Parallel 143MHz 5.4ns 54-TFBGA (8x8); MANUFACTURER: ISSI; PART_NUMBER: IS42S16160J-7BLI; VOLTAGE: 3.3V

## Module WIFI_BLUETOOTH
Ports: SPI2_CLK(in) SPI2_MOSI(in) SPI2_MISO(out) SPI2_CS(in) ESP32_U0RX(in) ESP32_U0TX(out) RESET_ESP32_L(in) ESP32_BOOT_L(in) GND(pwr) VCC(pwr) MTCK(io) MTDI(io) MTDO(io) MTMS(io) ADC2_CH0(in) ESP32_IO22(out)
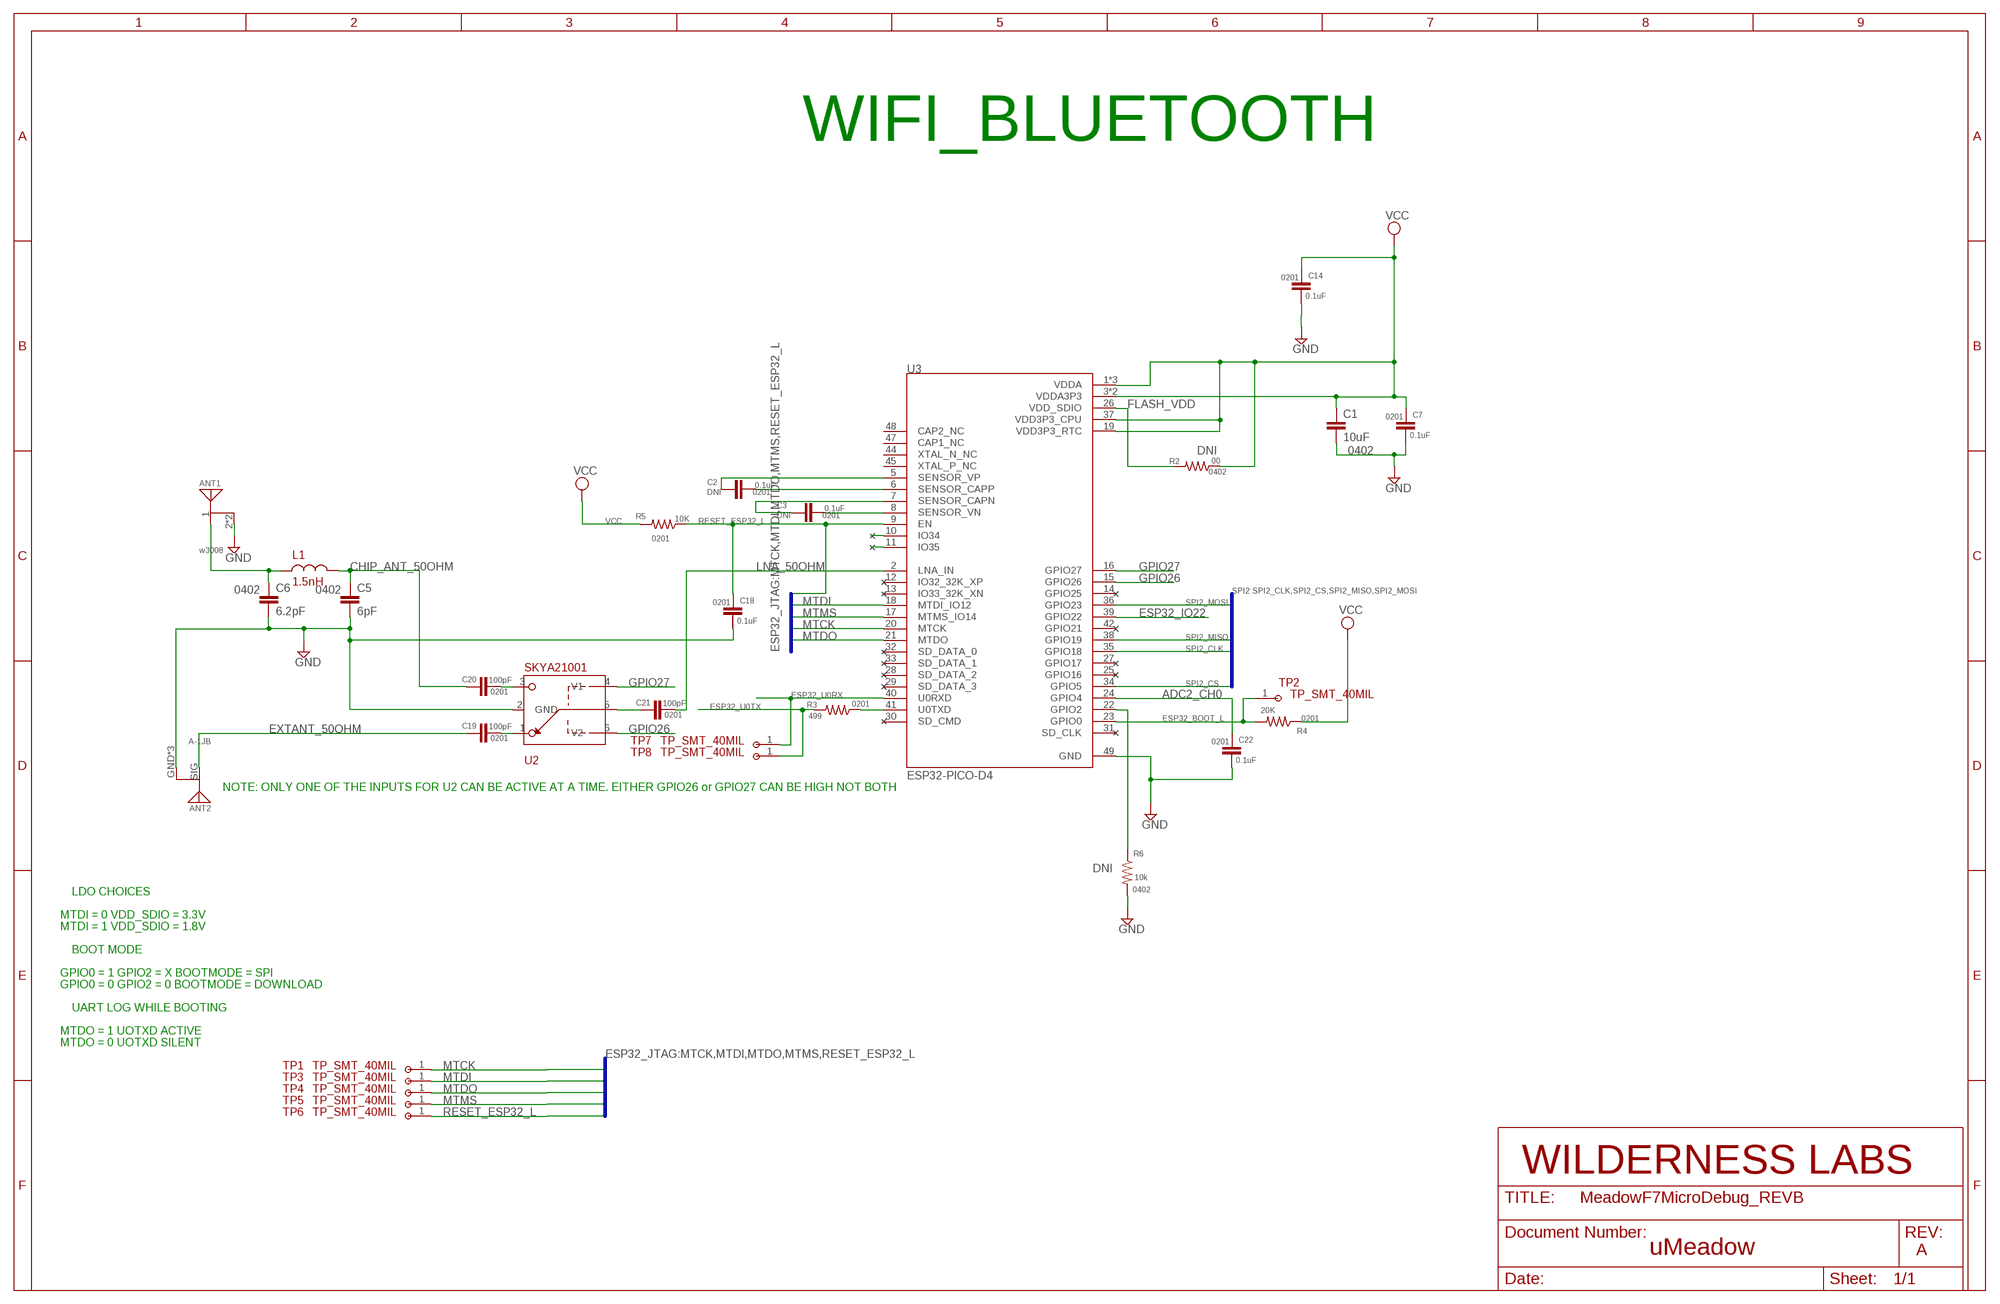
[diagram p4: schematic, module WIFI_BLUETOOTH, sheet 1]

### Parts
ANT1  w3008  W3008  [W3008]
ANT2  A-1JB  [A-1JB]
C1  10uF  C-EUC0402  [C0402]
C2  0.1uF  CC0201  [C0201]
C3  0.1uF  CC0201  [C0201]
C5  6pF  CC0402  [C0402]
C6  6.2pF  CC0402  [C0402]
C7  0.1uF  CC0201  [C0201]
C14  0.1uF  CC0201  [C0201]
C18  0.1uF  CC0201  [C0201]
C19  100pF  CC0201  [C0201]
C20  100pF  CC0201  [C0201]
C21  100pF  CC0201  [C0201]
C22  0.1uF  CC0201  [C0201]
L1  1.5nH  L_1_5NH_0402  [L0402]
R2  00  R-US_R0402  [R0402]
R3  499  R-US_R0201  [R0201]
R4  20K  R-US_R0201  [R0201]
R5  10K  R-US_R0201  [R0201]
R6  10k  R-US_R0402  [R0402]
TP1  TP_SMT_40MIL  [TP_SMT_40MIL]
TP2  TP_SMT_40MIL  [TP_SMT_40MIL]
TP3  TP_SMT_40MIL  [TP_SMT_40MIL]
TP4  TP_SMT_40MIL  [TP_SMT_40MIL]
TP5  TP_SMT_40MIL  [TP_SMT_40MIL]
TP6  TP_SMT_40MIL  [TP_SMT_40MIL]
TP7  TP_SMT_40MIL  [TP_SMT_40MIL]
TP8  TP_SMT_40MIL  [TP_SMT_40MIL]
U2  SKYA21001  [SC70-6L]
U3  ESP32-PICO-D4  [QFN50P700X700X104-49T550]

### Nets
ADC2_CH0: C22.1 U3.24(GPIO4)
CHIP_ANT_50OHM [ANT]: C5.1 C20.1 L1.2
ESP32_BOOT_L: R4.2 TP2.1 U3.23(GPIO0)
ESP32_IO22: U3.39(GPIO22)
ESP32_U0RX: TP7.1 U3.40(U0RXD)
ESP32_U0TX: R3.2 TP8.1
EXTANT_50OHM [ANT]: ANT2.SIG(FEED) C19.1
FLASH_VDD: R2.2 U3.26(VDD_SDIO)
GND: ANT1.2(GND) ANT1.3(GND) ANT2.GND ANT2.GND1(GND) ANT2.GND2(GND) C1.2 C5.2 C6.2 C7.2 C14.2 C18.2 C22.2 R6.2 U2.2(GND) U3.49(GND)
GPIO2: R6.1 U3.22(GPIO2)
GPIO26: U2.6(V2) U3.15(GPIO26)
GPIO27: U2.4(V1) U3.16(GPIO27)
LNA_50OHM [ANT]: C21.2 U3.2(LNA_IN)
MTCK: TP1.1 U3.20(MTCK)
MTDI: TP3.1 U3.18(MTDI_IO12)
MTDO: TP4.1 U3.21(MTDO)
MTMS: TP5.1 U3.17(MTMS_IO14)
N$3: C3.2 U3.8(SENSOR_VN)
N$4: C2.1 U3.5(SENSOR_VP)
N$5: C2.2 U3.6(SENSOR_CAPP)
N$7: C3.1 U3.7(SENSOR_CAPN)
N$8 [ANT]: ANT1.1(FEED) C6.1 L1.1
N$9 [MEM_DATA]: U3.10(IO34)
N$10: R3.1 U3.41(U0TXD)
N$12 [MEM_DATA]: U3.11(IO35)
N$13: C20.2 U2.3(J2)
N$14: C19.2 U2.1(J3)
N$15: C21.1 U2.5(J1)
RESET_ESP32_L: C18.1 R5.1 TP6.1 U3.9(EN)
SPI2_CLK: U3.35(GPIO18)
SPI2_CS: U3.34(GPIO5)
SPI2_MISO: U3.38(GPIO19)
SPI2_MOSI: U3.36(GPIO23)
VCC: C1.1 C7.1 C14.1 R2.1 R4.1 R5.2 U3.1(VDDA) U3.3(VDDA3P3) U3.4(VDDA3P3) U3.19(VDD3P3_RTC) U3.37(VDD3P3_CPU) U3.43(VDDA) U3.46(VDDA)
Unconnected: U3.12(IO32_32K_XP) U3.13(IO33_32K_XN) U3.14(GPIO25) U3.25(GPIO16) U3.27(GPIO17) U3.28(SD_DATA_2) U3.29(SD_DATA_3) U3.30(SD_CMD) U3.31(SD_CLK) U3.32(SD_DATA_0) U3.33(SD_DATA_1) U3.42(GPIO21) U3.44(XTAL_N_NC) U3.45(XTAL_P_NC) U3.47(CAP1_NC) U3.48(CAP2_NC)

### Buses
SPI2:SPI2_CLK,SPI2_CS,SPI2_MISO,SPI2_MOSI
ESP32_JTAG:MTCK,MTDI,MTDO,MTMS,RESET_ESP32_L

### Notes on the sheet
- NOTE: ONLY ONE OF THE INPUTS FOR U2 CAN BE ACTIVE AT A TIME. EITHER GPIO26 or GPIO27 CAN BE HIGH NOT BOTH
- LDO CHOICES
- MTDI = 0 VDD_SDIO = 3.3V
- MTDI = 1 VDD_SDIO = 1.8V
- BOOT MODE
- GPIO0 = 1 GPIO2 = X BOOTMODE = SPI
- GPIO0 = 0 GPIO2 = 0 BOOTMODE = DOWNLOAD
- UART LOG WHILE BOOTING
- MTDO = 1 UOTXD ACTIVE
- MTDO = 0 UOTXD SILENT

### Library data of the parts
ANT1 = SLJ_wireless:W3008: 2.4GHz Bluetooth Chip RF Antenna 2.4GHz ~ 2.483GHz 1.7dBi Solder Surface Mount; MANUFACTURER: PulseLarsen; PART_NUMBER: W3008
ANT2 = SLJ_wireless:A-1JB: Ultra Miniature Coaxial Connector Jack, Male Pin 50 Ohm Surface Mount Solder; MANUFACTURER: amphenol RF; PART_NUMBER: A-1JB
C1 = rcl:C-EU: CAPACITOR, European symbol; MANUFACTURER: MURATA; PACKAGE: 0402; PART_NUMBER: GRM155R60J106ME15D; SPICEPREFIX: C
C2 C3 = eagle-ltspice:C: CAPACITOR, European symbol; DNI: DNI; FOOTPRINT: 0201; MANUFACTURER: Murata Electronica; PART_NUMBER: GRM033R61A104ME15D; SPICEMODEL: NONE; SPICEPREFIX: C; VOLTAGE: 10V
C5 = eagle-ltspice:C: CAPACITOR, European symbol; FOOTPRINT: 0402; MANUFACTURER: Murata Electronica; PART_NUMBER: GJM1555C1H6R0BB01D; SPICEMODEL: NONE; SPICEPREFIX: C; VOLTAGE: 50V
C6 = eagle-ltspice:C: CAPACITOR, European symbol; FOOTPRINT: 0402; MANUFACTURER: Murata Electronica; PART_NUMBER: GRM1555C1H6R2BA01D; SPICEMODEL: NONE; SPICEPREFIX: C; VOLTAGE: 50V
C7 C14 C18 C22 = eagle-ltspice:C: CAPACITOR, European symbol; FOOTPRINT: 0201; MANUFACTURER: Murata Electronica; PART_NUMBER: GRM033R61A104ME15D; SPICEMODEL: NONE; SPICEPREFIX: C; VOLTAGE: 10V
C19 C20 = eagle-ltspice:C: CAPACITOR, European symbol; FOOTPRINT: 0201; MANUFACTURER: MURATA; PART_NUMBER: GRM0335C1H101JA01D; SPICEMODEL: NONE; SPICEPREFIX: C; VOLTAGE: 10V
C21 = eagle-ltspice:C: CAPACITOR, European symbol; FOOTPRINT: 0201; MANUFACTURER: Murata; PART_NUMBER: GRM0335C1H101JA01D; SPICEMODEL: NONE; SPICEPREFIX: C; VOLTAGE: 10V
L1 = SLJ_passives:L_1_5NH_0402: FIXED IND 1.5NH 300MA 130 MOHM FOOTPRINT: 0402 Manufacturer: Johanson Part Number: L-07C1N5SV6T; CURRENT: 300mA; FOOTPRINT: 0402; MANUFACTURER: Johanson Technology; PART_NUMBER: L-07C1N5SV6T
R2 = rcl:R-US_: RESISTOR, American symbol; DNI: DNI; FOOTPRINT: 0402; MANUFACTURER: Panasonic; PART_NUMBER: ERJ-2GE0R00X; SPICEPREFIX: R
R3 = rcl:R-US_: RESISTOR, American symbol; FOOTPRINT: 0201; MANUFACTURER: PANASONIC; PART_NUMBER: ERJ-1GNF4990C; SPICEPREFIX: R
R4 = rcl:R-US_: RESISTOR, American symbol; FOOTPRINT: 0201; MANUFACTURER: YAGEO; PART_NUMBER: RC0201FR-0720KL; SPICEPREFIX: R
R5 = rcl:R-US_: RESISTOR, American symbol; FOOTPRINT: 0201; MANUFACTURER: Yageo; PART_NUMBER: RC0201FR-0710KL; SPICEPREFIX: R
R6 = rcl:R-US_: RESISTOR, American symbol; DNI: DNI; FOOTPRINT: 0402; MANUFACTURER: Stackpole; PART_NUMBER: RMCF0402FT10K0; SPICEPREFIX: R
TP1-TP8 = SLJ_MECH:TP_SMT_40MIL: SMT Test point
U2 = SLJ_wireless:SKYA21001: RF Switch IC Bluetooth, WLAN SPDT 3GHz 50 Ohm SC-70-6; MANUFACTURER: Skyworks Solutions; PART_NUMBER: SKYA21001
U3 = SLJ_wireless:ESP32-PICO-D4: ESP32 is a single 2.4 GHz Wi-Fi-and-Bluetooth combo chip designed with the TSMC ultra-low-power 40 nm technology. It is designed to achieve the best power and RF performance, showing robustness, versatility and reliability in a wide variety of applications and power scenarios.; MANUFACTURER: Espressif Systems; PART_NUMBER: ESP32-PICO-D4

## Module HEADERS
Ports: A0(io) A1(io) A2(out) A3(out) A4(out) A5(out) SPI_CLK(io) SPI_MOSI(io) SPI_MISO(io) COM1_RX(out) COM1_TX(in) COM2_TX(in) COM2_RX(out) D14(io) D15(io) D03_CAN1_RX(io) D04_CAN1_TX(io) I2C_SDA(io) I2C_SCK(io) D02(io) D5(io) D6(io) D9(io) D10(io) D11(io) RESET_L(io) EN_3V3(out) +5V(pwr) +3V3(pwr) GND(pwr) VBAT(pwr) VREF+(pwr)
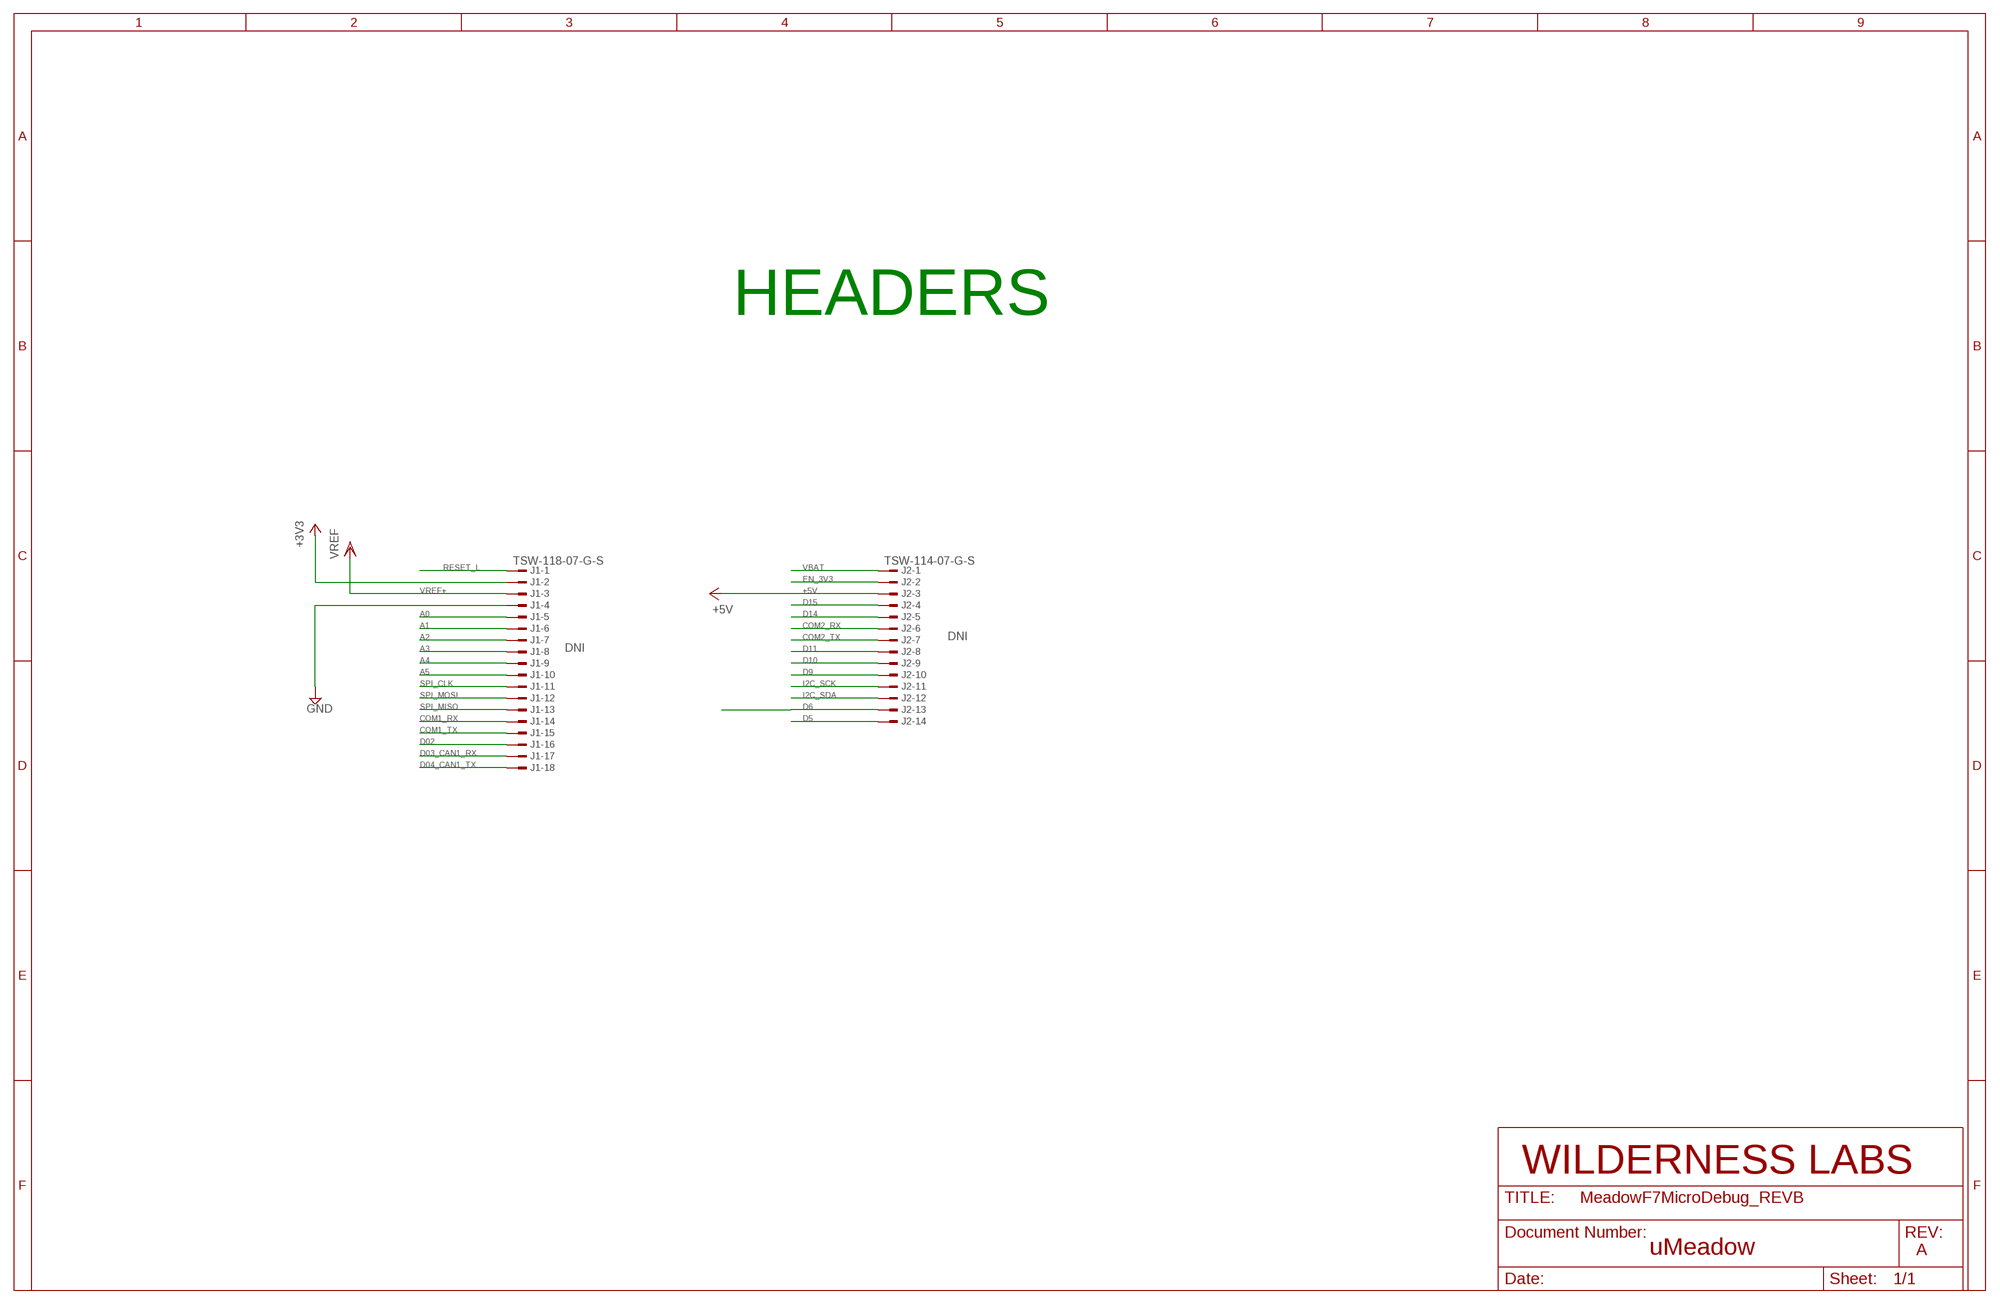
[diagram p5: schematic, module HEADERS, sheet 1]

### Parts
J1  TSW-118-07-G-S  [TSW-118-XX-G-S]
J2  TSW-114-07-G-S  [TSW-114-XX-G-S]

### Nets
+3V3: J1.2
+5V: J2.3
A0: J1.5
A1: J1.6
A2: J1.7
A3: J1.8
A4: J1.9
A5: J1.10
COM1_RX: J1.14
COM1_TX: J1.15
COM2_RX: J2.6
COM2_TX: J2.7
D02: J1.16
D03_CAN1_RX: J1.17
D04_CAN1_TX: J1.18
D5: J2.14
D6: J2.13
D9: J2.10
D10: J2.9
D11: J2.8
D14: J2.5
D15: J2.4
EN_3V3: J2.2
GND: J1.4
I2C_SCK: J2.11
I2C_SDA: J2.12
RESET_L: J1.1
SPI_CLK: J1.11
SPI_MISO: J1.13
SPI_MOSI: J1.12
VBAT: J2.1
VREF+: J1.3 ; supply symbol labelled VREF

### Library data of the parts
J1 = con-samtec:TSW-118-*-G-S: THROUGH-HOLE .025" SQ POST HEADER Source: Samtec TSW.pdf; DNI: DNI; MANUFACTURER: Samtec; MF: Samtec Inc.; MPN: TSW-118-07-G-S; PART_NUMBER: TSW-118-07-G-S
J2 = con-samtec:TSW-114-*-G-S: THROUGH-HOLE .025" SQ POST HEADER Source: Samtec TSW.pdf; DNI: DNI; MF: Samtec Inc.; MPN: TSW-114-07-G-S

## Module POWER
Ports: +5V(pwr) +3V3(pwr) +VBAT(pwr) EN_3V3(in) GND(pwr) +VBUS(pwr) VBAT_MEAS(out)
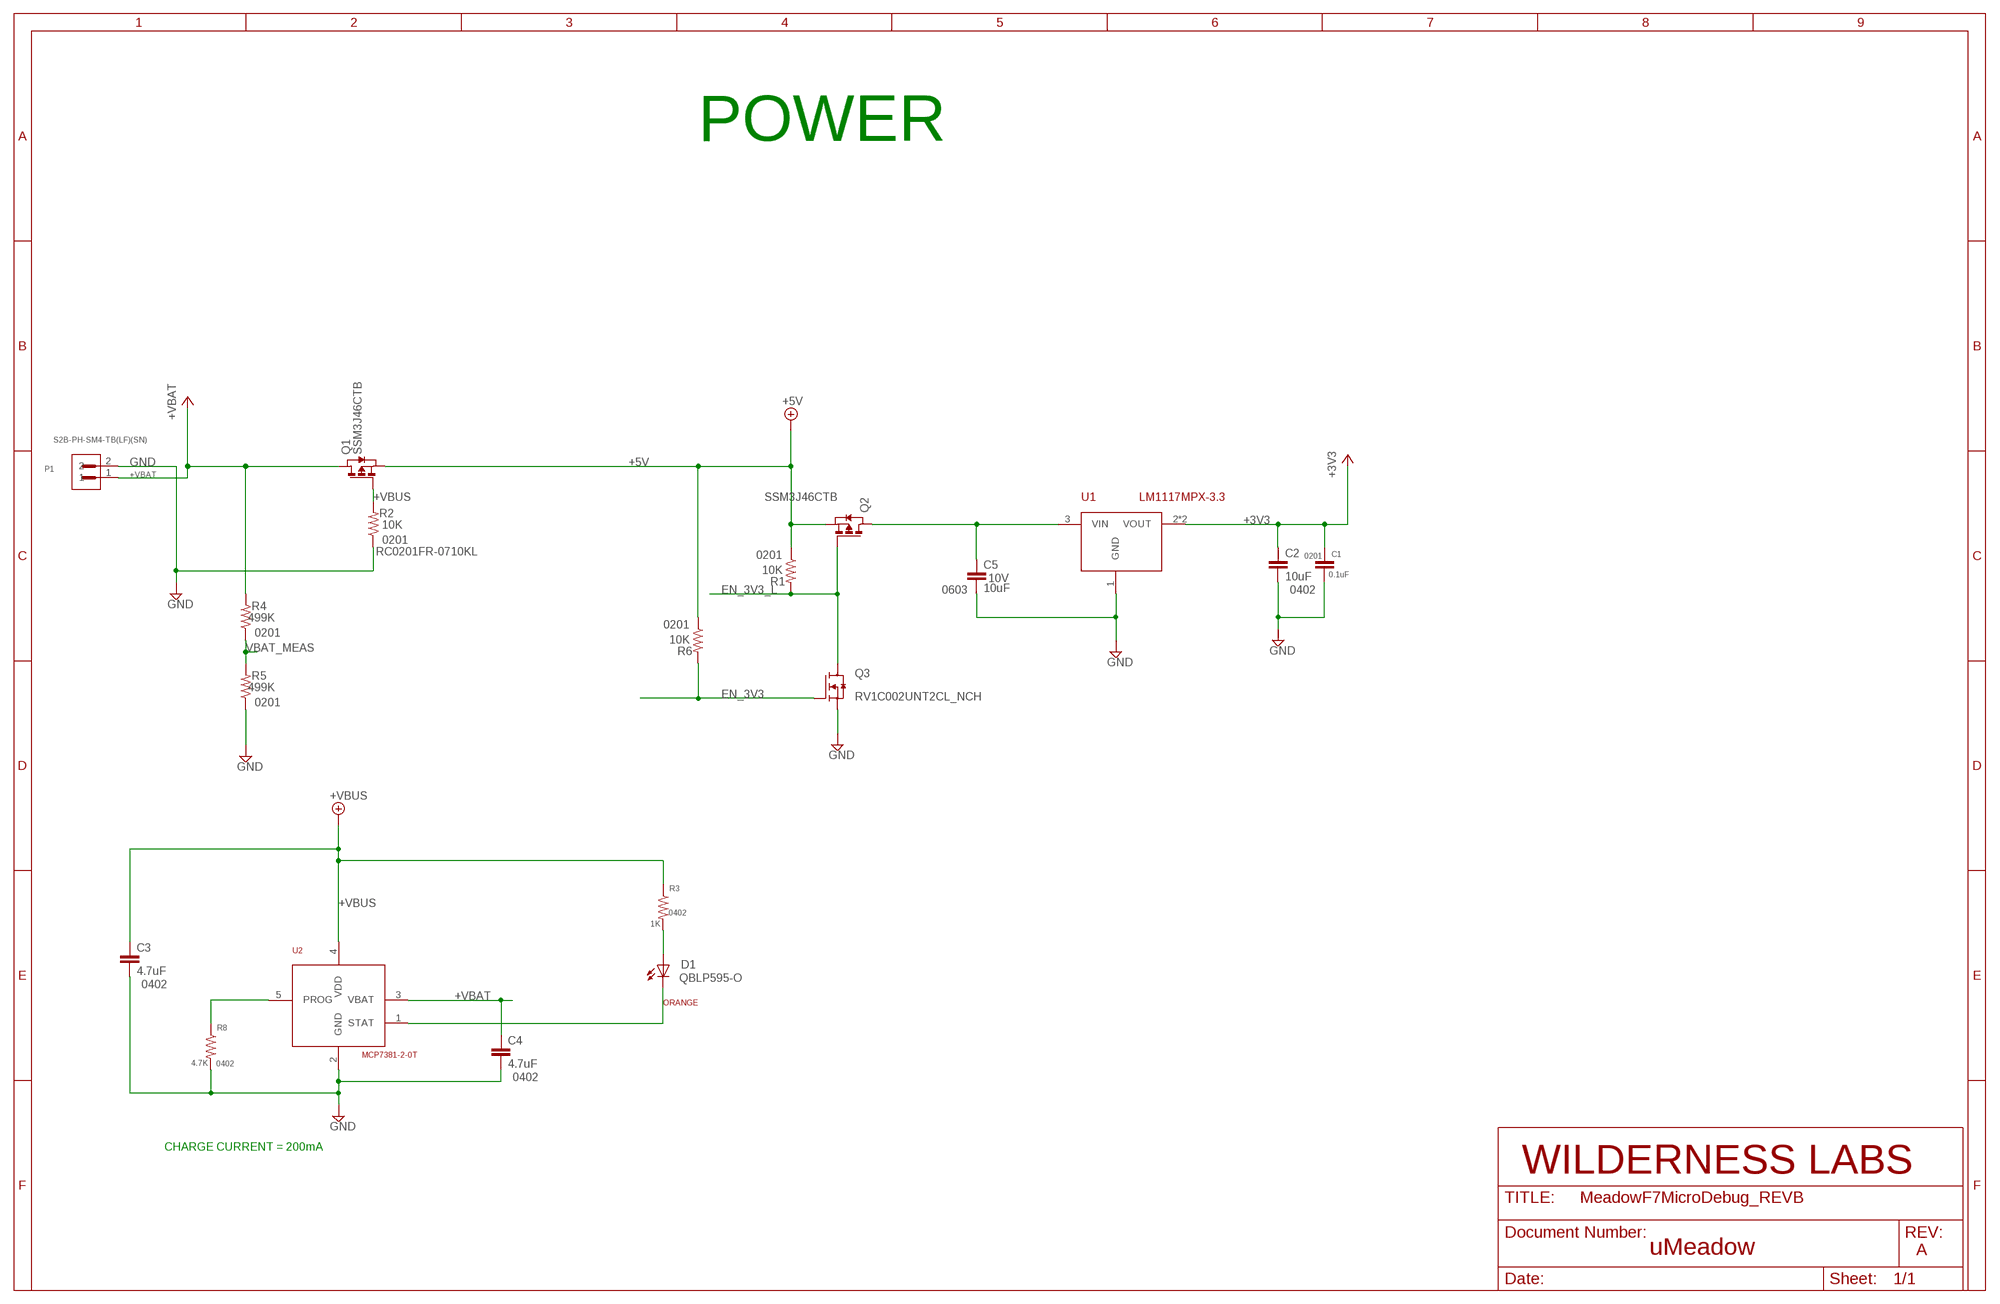
[diagram p6: schematic, module POWER, sheet 1]

### Parts
C1  0.1uF  CC0201  [C0201]
C2  10uF  C-EUC0402  [C0402]
C3  4.7uF  C-EUC0402  [C0402]
C4  4.7uF  C-EUC0402  [C0402]
C5  10uF  C-EUC0603  [C0603]
D1  QBLP595-O  [LEDC1005X50]
P1  S2B-PH-SM4-TB(LF)(SN)  [JST_S2B-PH-SM4-TB(LF)(SN)]
Q1  SSM3J46CTB  [DFN120X80X50-3]
Q2  SSM3J46CTB  [DFN120X80X50-3]
Q3  RV1C002UNT2CL_NCH  [DFN80X60X40-3]
R1  10K  R-US_R0201  [R0201]
R2  10K  R-US_R0201  [R0201]
R3  1K  R-US_R0402  [R0402]
R4  499K  R-US_R0201  [R0201]
R5  499K  R-US_R0201  [R0201]
R6  10K  R-US_R0201  [R0201]
R8  4.7K  R-US_R0402  [R0402]
U1  LM1117MPX-3.3  [SOT230P700X180-4]
U2  MCP7381-2-0T  [SOT95P270X145-5]

### Nets
+3V3 [MEM_DATA]: C1.1 C2.1 U1.2(VOUT) U1.4(VOUT)
+5V [5V]: Q1.2(S) Q2.2(S) R1.1 R6.1
+VBAT: C4.1 P1.1 Q1.3(D) R4.2 U2.3(VBAT)
+VBUS: C3.1 Q1.1(G) R2.2 R3.1 U2.4(VDD)
EN_3V3: Q3.1(G) R6.2
EN_3V3_L: Q2.1(G) Q3.3(D) R1.2
GND: C1.2 C2.2 C3.2 C4.2 C5.2 P1.2 Q3.2(S) R2.1 R5.1 R8.2 U1.1(GND) U2.2(GND)
N$1: R8.1 U2.5(PROG)
N$2: D1.1(C) U2.1(STAT)
N$3: D1.2(A) R3.2
N$4: C5.1 Q2.3(D) U1.3(VIN)
VBAT_MEAS: R4.1 R5.2

### Notes on the sheet
- CHARGE CURRENT = 200mA

### Library data of the parts
C1 = eagle-ltspice:C: CAPACITOR, European symbol; FOOTPRINT: 0201; MANUFACTURER: Murata Electronica; PART_NUMBER: GRM033C71A104KE14D; SPICEMODEL: NONE; SPICEPREFIX: C; VOLTAGE: 10V
C2 = rcl:C-EU: CAPACITOR, European symbol; MANUFACTURER: MURATA; PACKAGE: 0402; PART_NUMBER: GRM155R60J106ME15D; SPICEPREFIX: C
C3 C4 = rcl:C-EU: CAPACITOR, European symbol; MANUFACTURER: MURATA; PACKAGE: 0402; PART_NUMBER: GRM155R60J475ME87D; SPICEPREFIX: C
C5 = rcl:C-EU: CAPACITOR, European symbol; FOOTPRINT: 0603; MANUFACTURER: Murata Electronics North America; PART_NUMBER: GRM188R61A106ME69D; SPICEPREFIX: C; VOLTAGE: 10V
D1 = SLJ_Diodes:QBLP595-O: Orange 605nm LED Indication - Discrete 2V 0402 (1005 Metric); COLOR: ORANGE; MANUFACTURER: QT BRIGHTEK; PART_NUMBER: QBLP595-O
P1 = SLJ_Connectors:S2B-PH-SM4-TB(LF)(SN): CONN HEADER PH SIDE 2POS 2MM SMD; DESCRIPTION: PH Series 2 Position 2 mm Pitch Surface Mount Side Entry Shrouded Header; MANUFACTURER: JST; PACKAGE: FakePackage u; PART_NUMBER: S2B-PH-SM4-TB_LF__SN_; PRICE: None
Q1 Q2 = SLJ_TRANSISTORS:SSM3J46CTB: P-Channel 20V 2A (Ta) Surface Mount CST3B; CURRENT: 2A; MANUFACTURER: Toshiba Semiconductor; PART_NUMBER: SSM3J46CTB(TPL3); VOLTAGE: 20V
Q3 = SLJ_TRANSISTORS:RV1C002UNT2CL_NCH: N-Channel 20V 150mA (Ta) 100mW (Ta) Surface Mount VML0806; MANUFACTURER: Rohm Semiconductor; PART_NUMBER: RV1C002UNT2CL
R1 R6 = rcl:R-US_: RESISTOR, American symbol; FOOTPRINT: 0201; MANUFACTURER: Panasonic; PART_NUMBER: RC0201FR-0710KL; SPICEPREFIX: R
R2 = rcl:R-US_: RESISTOR, American symbol; FOOTPRINT: 0201; MANUFACTURER: Yageo; PART_NUMBER: RC0201FR-0710KL; SPICEPREFIX: R
R3 = rcl:R-US_: RESISTOR, American symbol; FOOTPRINT: 0402; MANUFACTURER: VISHAY; PART_NUMBER: MCS04020C1001FE000; SPICEPREFIX: R
R4 R5 = rcl:R-US_: RESISTOR, American symbol; FOOTPRINT: 0201; MANUFACTURER: Yageo; PART_NUMBER: RC0201FR-07499KL; SPICEPREFIX: R
R8 = rcl:R-US_: RESISTOR, American symbol; FOOTPRINT: 0402; MANUFACTURER: Panasonic; PART_NUMBER: ERA-2AEB472X; SPICEPREFIX: R
U1 = SLJ_PMIC:LM1117MPX-3.3: Linear Voltage Regulator IC Positive Fixed 1 Output 3.3V 800mA SOT-223-4; MANUFACTURER: Texas Instruments; PART_NUMBER: LM1117MPX-3.3/NOPB
U2 = SLJ_PMIC:MCP7381-2-0T: Charger IC Lithium-Ion/Polymer SOT-23-5; MANUFACTURER: MicroChip; PART_NUMBER: MCP73831T-2ACI/OT

## Module DEBUG
Ports: USB0_UART_TX(out) USB0_UART_RX(in) +3V3(pwr) GND(pwr) ESP32_MTCK(io) ESP32_MTDI(io) ESP32_MTDO(io) ESP32_MTMS(io) RESET_ESP32_L(out) SWCLK/JTCK(io) SWDIO/JTMS(io) JTDI(io) JTDO(io) RESET_L(io) +5V(pwr) USB1_UART_TX(out) USB1_UART_RX(in) ESP32_GPIO0(out) ESP32_BLINKY(in)
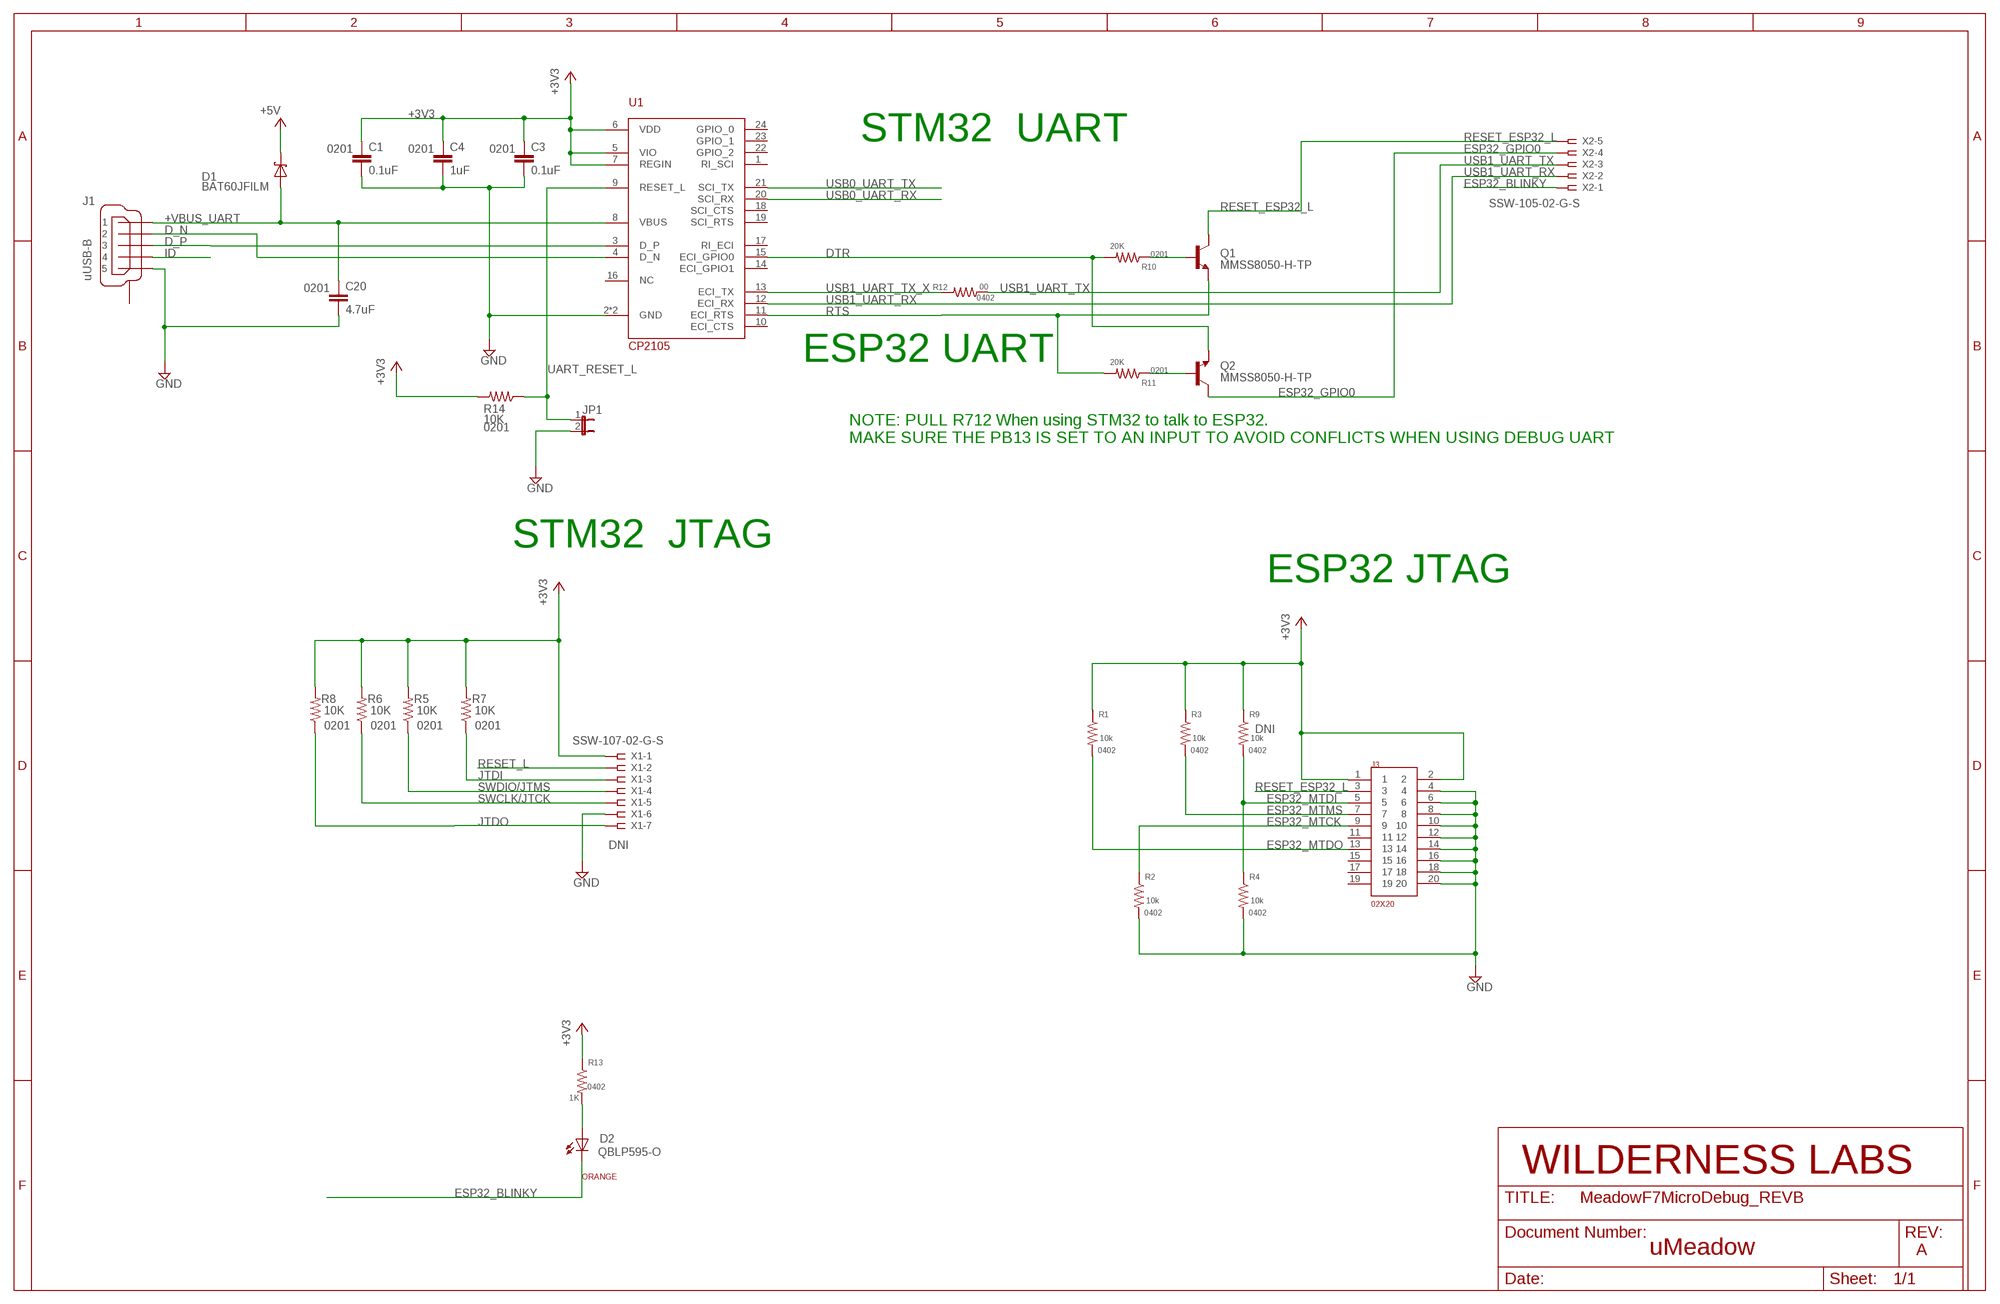
[diagram p7: schematic, module DEBUG, sheet 1]

### Parts
C1  0.1uF  CC0201  [C0201]
C3  0.1uF  CC0201  [C0201]
C4  1uF  CC0201  [C0201]
C20  4.7uF  CC0201  [C0201]
D1  BAT60JFILM  [SOD2512X117]
D2  QBLP595-O  [LEDC1005X50]
J1  uUSB-B  MICROUSB_0473461001  [USB_473461001]
J3  02X20  CON_02X10_VERT_100  [HDRV20W64P254_2X10_3276X876X838B]
JP1  JP1E  [JP1]
Q1  MMSS8050-H-TP  [SOT-23]
Q2  MMSS8050-H-TP  [SOT-23]
R1  10k  R-US_R0402  [R0402]
R2  10k  R-US_R0402  [R0402]
R3  10k  R-US_R0402  [R0402]
R4  10k  R-US_R0402  [R0402]
R5  10K  R-US_R0201  [R0201]
R6  10K  R-US_R0201  [R0201]
R7  10K  R-US_R0201  [R0201]
R8  10K  R-US_R0201  [R0201]
R9  10k  R-US_R0402  [R0402]
R10  20K  R-US_R0201  [R0201]
R11  20K  R-US_R0201  [R0201]
R12  00  R-US_R0402  [R0402]
R13  1K  R-US_R0402  [R0402]
R14  10K  R-US_R0201  [R0201]
U1  CP2105  CP2105-F01-GM  [QFN50P400X400X80-25T280]
X1  SSW-107-02-G-S  [SSW-107-02-G-S]
X2  SSW-105-02-G-S  [SSW-105-02-G-S]

### Nets
+3V3: C1.1 C3.1 C4.1 J3.1 J3.2 R1.1 R3.1 R5.2 R6.2 R7.2 R8.2 R9.1 R13.1 R14.2 U1.5(VIO) U1.6(VDD) U1.7(REGIN) X1.1
+5V: D1.1(C)
+VBUS_UART: C20.1 D1.2(A) J1.1 U1.8(VBUS)
D_N [USB]: J1.2 U1.4(D_N)
D_P [USB]: J1.3 U1.3(D_P)
DTR: Q2.2(E) R10.2 U1.15(ECI_GPIO0)
ESP32_BLINKY: D2.1(C) X2.1
ESP32_GPIO0: Q2.1(C) X2.4
ESP32_MTCK: J3.9 R2.1
ESP32_MTDI: J3.5 R4.1 R9.2
ESP32_MTDO: J3.13 R1.2
ESP32_MTMS: J3.7 R3.2
GND: C1.2 C3.2 C4.2 C20.2 J1.5 J3.4 J3.6 J3.8 J3.10 J3.12 J3.14 J3.16 J3.18 J3.20 JP1.2 R2.2 R4.2 U1.2(GND) U1.25(GND) X1.6
ID: J1.4
JTDI: R7.1 X1.3
JTDO: R8.1 X1.7
N$1: Q1.3(B) R10.1
N$2: Q2.3(B) R11.1
N$5: D2.2(A) R13.2
RESET_ESP32_L: J3.3 Q1.1(C) X2.5
RESET_L [MEM_DATA]: X1.2
RTS: Q1.2(E) R11.2 U1.11(ECI_RTS)
SWCLK/JTCK: R6.1 X1.5
SWDIO/JTMS: R5.1 X1.4
UART_RESET_L: JP1.1 R14.1 U1.9(RESET_L)
USB0_UART_RX: U1.20(SCI_RX)
USB0_UART_TX: U1.21(SCI_TX)
USB1_UART_RX: U1.12(ECI_RX) X2.2
USB1_UART_TX: R12.1 X2.3
USB1_UART_TX_X: R12.2 U1.13(ECI_TX)
Unconnected: J1.SHD1(SHIELD) J1.SHD2(SHIELD) J1.SHD3(SHIELD) J1.SHD4(SHIELD) J1.SHD5(SHIELD) J1.SHD6(SHIELD) J3.11 J3.15 J3.17 J3.19 U1.1(RI_SCI) U1.10(ECI_CTS) U1.14(ECI_GPIO1) U1.16(NC) U1.17(RI_ECI) U1.18(SCI_CTS) U1.19(SCI_RTS) U1.22(GPIO_2) U1.23(GPIO_1) U1.24(GPIO_0)

### Notes on the sheet
- STM32  UART
- ESP32 UART
- NOTE: PULL R712 When using STM32 to talk to ESP32.
  MAKE SURE THE PB13 IS SET TO AN INPUT TO AVOID CONFLICTS WHEN USING DEBUG UART
- STM32  JTAG
- ESP32 JTAG

### Library data of the parts
C1 C3 = eagle-ltspice:C: CAPACITOR, European symbol; FOOTPRINT: 0201; MANUFACTURER: Murata Electronica; PART_NUMBER: GRM033R61A104ME15D; SPICEMODEL: NONE; SPICEPREFIX: C; VOLTAGE: 10V
C4 = eagle-ltspice:C: CAPACITOR, European symbol; FOOTPRINT: 0201; MANUFACTURER: Murata Electronica; PART_NUMBER: GRT033R60J105ME13D; SPICEMODEL: NONE; SPICEPREFIX: C; VOLTAGE: 6.3V
C20 = eagle-ltspice:C: CAPACITOR, European symbol; FOOTPRINT: 0201; MANUFACTURER: Murata Electronica; PART_NUMBER: GRM035R60J475ME15D; SPICEMODEL: NONE; SPICEPREFIX: C; VOLTAGE: 6.3V
D1 = SLJ_Diodes:BAT60JFILM: Schottky Diode STM BAT60 http://www.st.com/content/ccc/resource/technical/document/datasheet/3d/d2/27/1d/20/e3/4d/48/CD00001944.pdf/files/CD00001944.pdf/jcr:content/translations/en.CD00001944.pdf; MANUFACTURER: STMicroelectronics; PART_NUMBER: BAT60JFILM
D2 = SLJ_Diodes:QBLP595-O: Orange 605nm LED Indication - Discrete 2V 0402 (1005 Metric); COLOR: ORANGE; MANUFACTURER: QT BRIGHTEK; PART_NUMBER: QBLP595-O
J1 = SLJ_Connectors:MICROUSB_0473461001: USB - micro B USB 2.0 Receptacle Connector 5 Position Surface Mount, Right Angle; MANUFACTURER: Molex; PART_NUMBER: 0473461001
J3 = SLJ_Connectors:CON_02X10_VERT_100: Connector Header Through Hole 20 position 0.100" (2.54mm); MANUFACTURER: AMPHENOL FCI; PART_NUMBER: 52601-S20-4LF
JP1 = jumper:JP1E: JUMPER
Q1 Q2 = SLJ_TRANSISTORS:MMSS8050-H-TP: Bipolar (BJT) Transistor NPN 25V 1.5A 100MHz 625mW Surface Mount SOT-23; FOOTPRINT: SOT-23; MANUFACTURER: Micro Commercial; PART_NUMBER: MMSS8050-H-TP
R1-R4 = rcl:R-US_: RESISTOR, American symbol; FOOTPRINT: 0402; MANUFACTURER: Stackpole; PART_NUMBER: RMCF0402FT10K0; SPICEPREFIX: R
R5-R8 R14 = rcl:R-US_: RESISTOR, American symbol; FOOTPRINT: 0201; MANUFACTURER: Panasonic; PART_NUMBER: ERJ-1GEF1002C; SPICEPREFIX: R
R9 = rcl:R-US_: RESISTOR, American symbol; DNI: DNI; FOOTPRINT: 0402; MANUFACTURER: Stackpole; PART_NUMBER: RMCF0402FT10K0; SPICEPREFIX: R
R10 R11 = rcl:R-US_: RESISTOR, American symbol; FOOTPRINT: 0201; MANUFACTURER: YAGEO; PART_NUMBER: RC0201FR-0720KL; SPICEPREFIX: R
R12 = rcl:R-US_: RESISTOR, American symbol; FOOTPRINT: 0402; MANUFACTURER: Panasonic; PART_NUMBER: ERJ-2GE0R00X; SPICEPREFIX: R
R13 = rcl:R-US_: RESISTOR, American symbol; FOOTPRINT: 0402; MANUFACTURER: VISHAY; PART_NUMBER: MCS04020C1001FE000; SPICEPREFIX: R
U1 = SLJ_IC:CP2105-F01-GM: USB TO DUAL UART BRIDGE; MANUFACTURER: SILICON LABS; PART_NUMBER: CP2105-F01-GM
X1 = con-samtec:SSW-107-02-G-S: THROUGH-HOLE .025" SQ POST SOCKET Source: Samtec SSW.pdf; DNI: DNI; MF: Samtec Inc.; MPN: SSW-107-02-G-S; OC_FARNELL: unknown; OC_NEWARK: 11P9433
X2 = con-samtec:SSW-105-02-G-S: THROUGH-HOLE .025" SQ POST SOCKET Source: Samtec SSW.pdf; MF: Samtec Inc.; MPN: SSW-105-02-G-S; OC_FARNELL: unknown; OC_NEWARK: 11P9399

## Net classes
1 USB: width 0.165 mm, drill 0.102 mm, clearance 0.254 mm
2 MEM_ADDR_CNT: width 0.102 mm, drill 0.102 mm
3 MEM_DATA: width 0.102 mm
4 5V: width 0.1 mm
5 50ohm: width 0.1 mm
6 POWER: width 0.1 mm, drill 0.203 mm
7 CLK: width 0.1 mm, drill 0.203 mm
8 ANT: clearance 0.3 mm